# Altium schematic sheet DSP大板子.SchDoc (part 1 of 7)
size 1054 x 800 mm; SheetNumber: 1; SheetTotal: 1
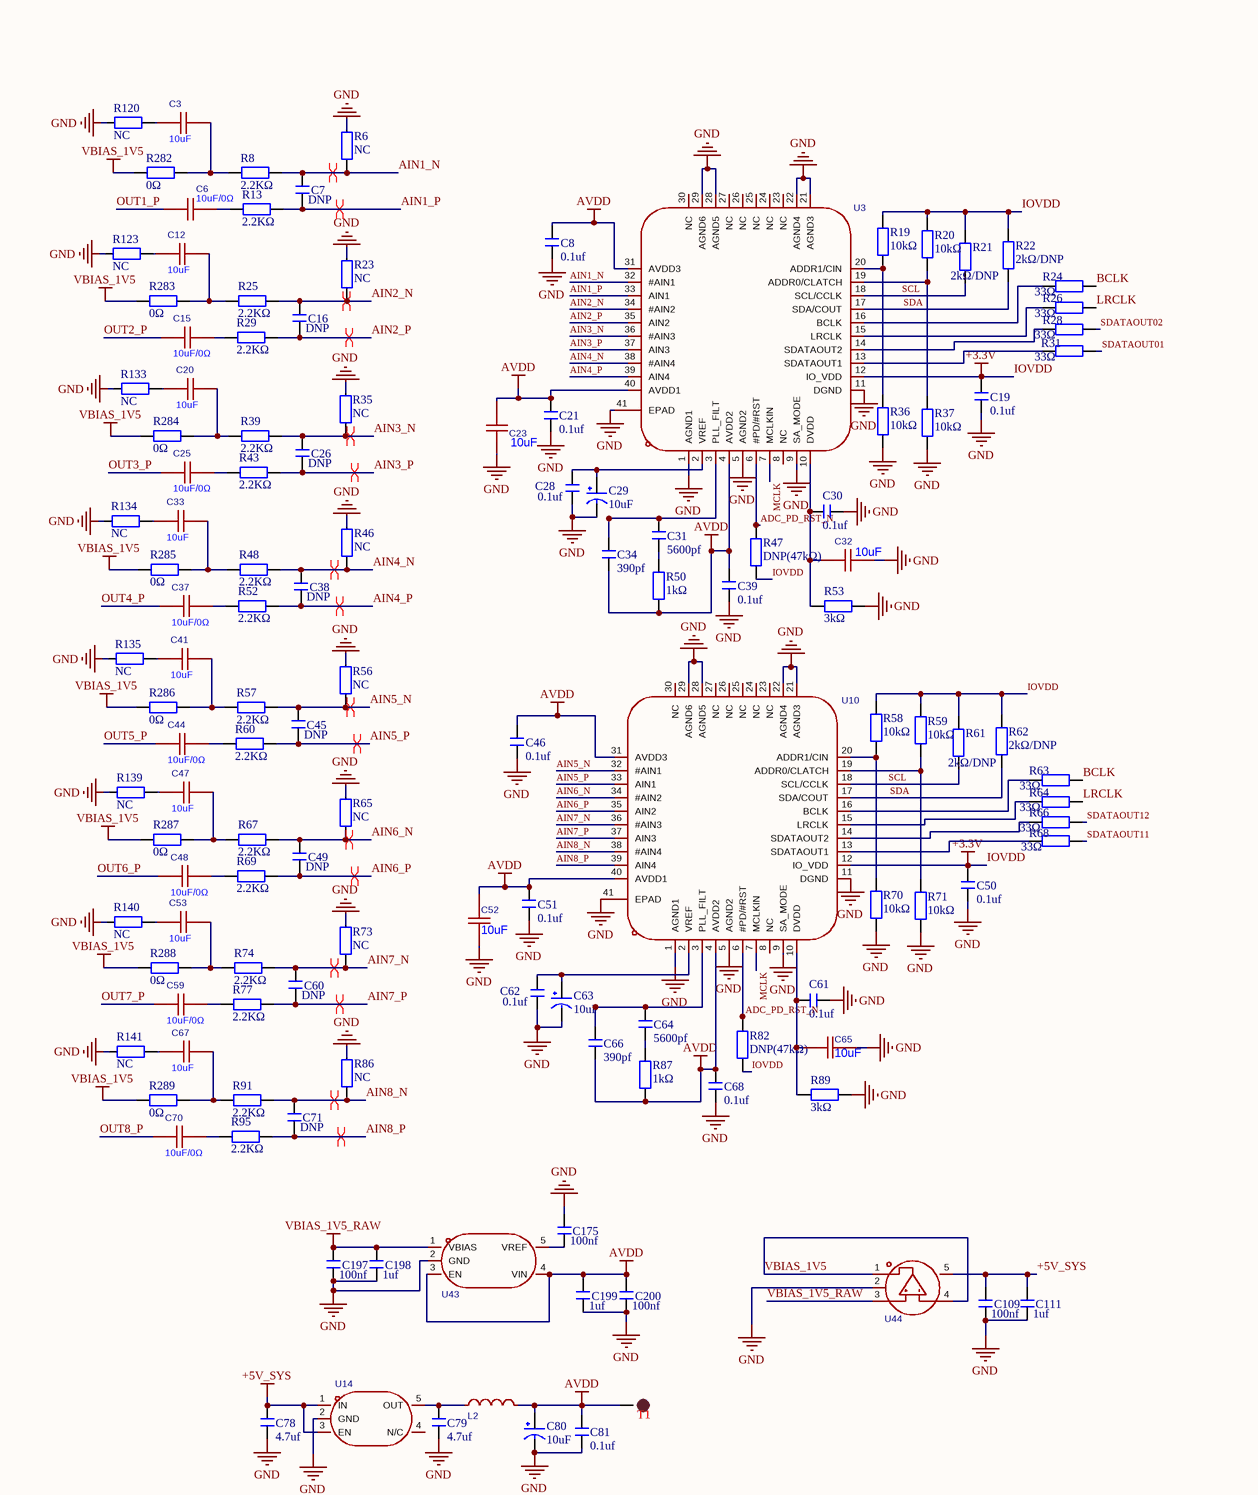
[diagram p0: DSP大板子.SchDoc, top left]
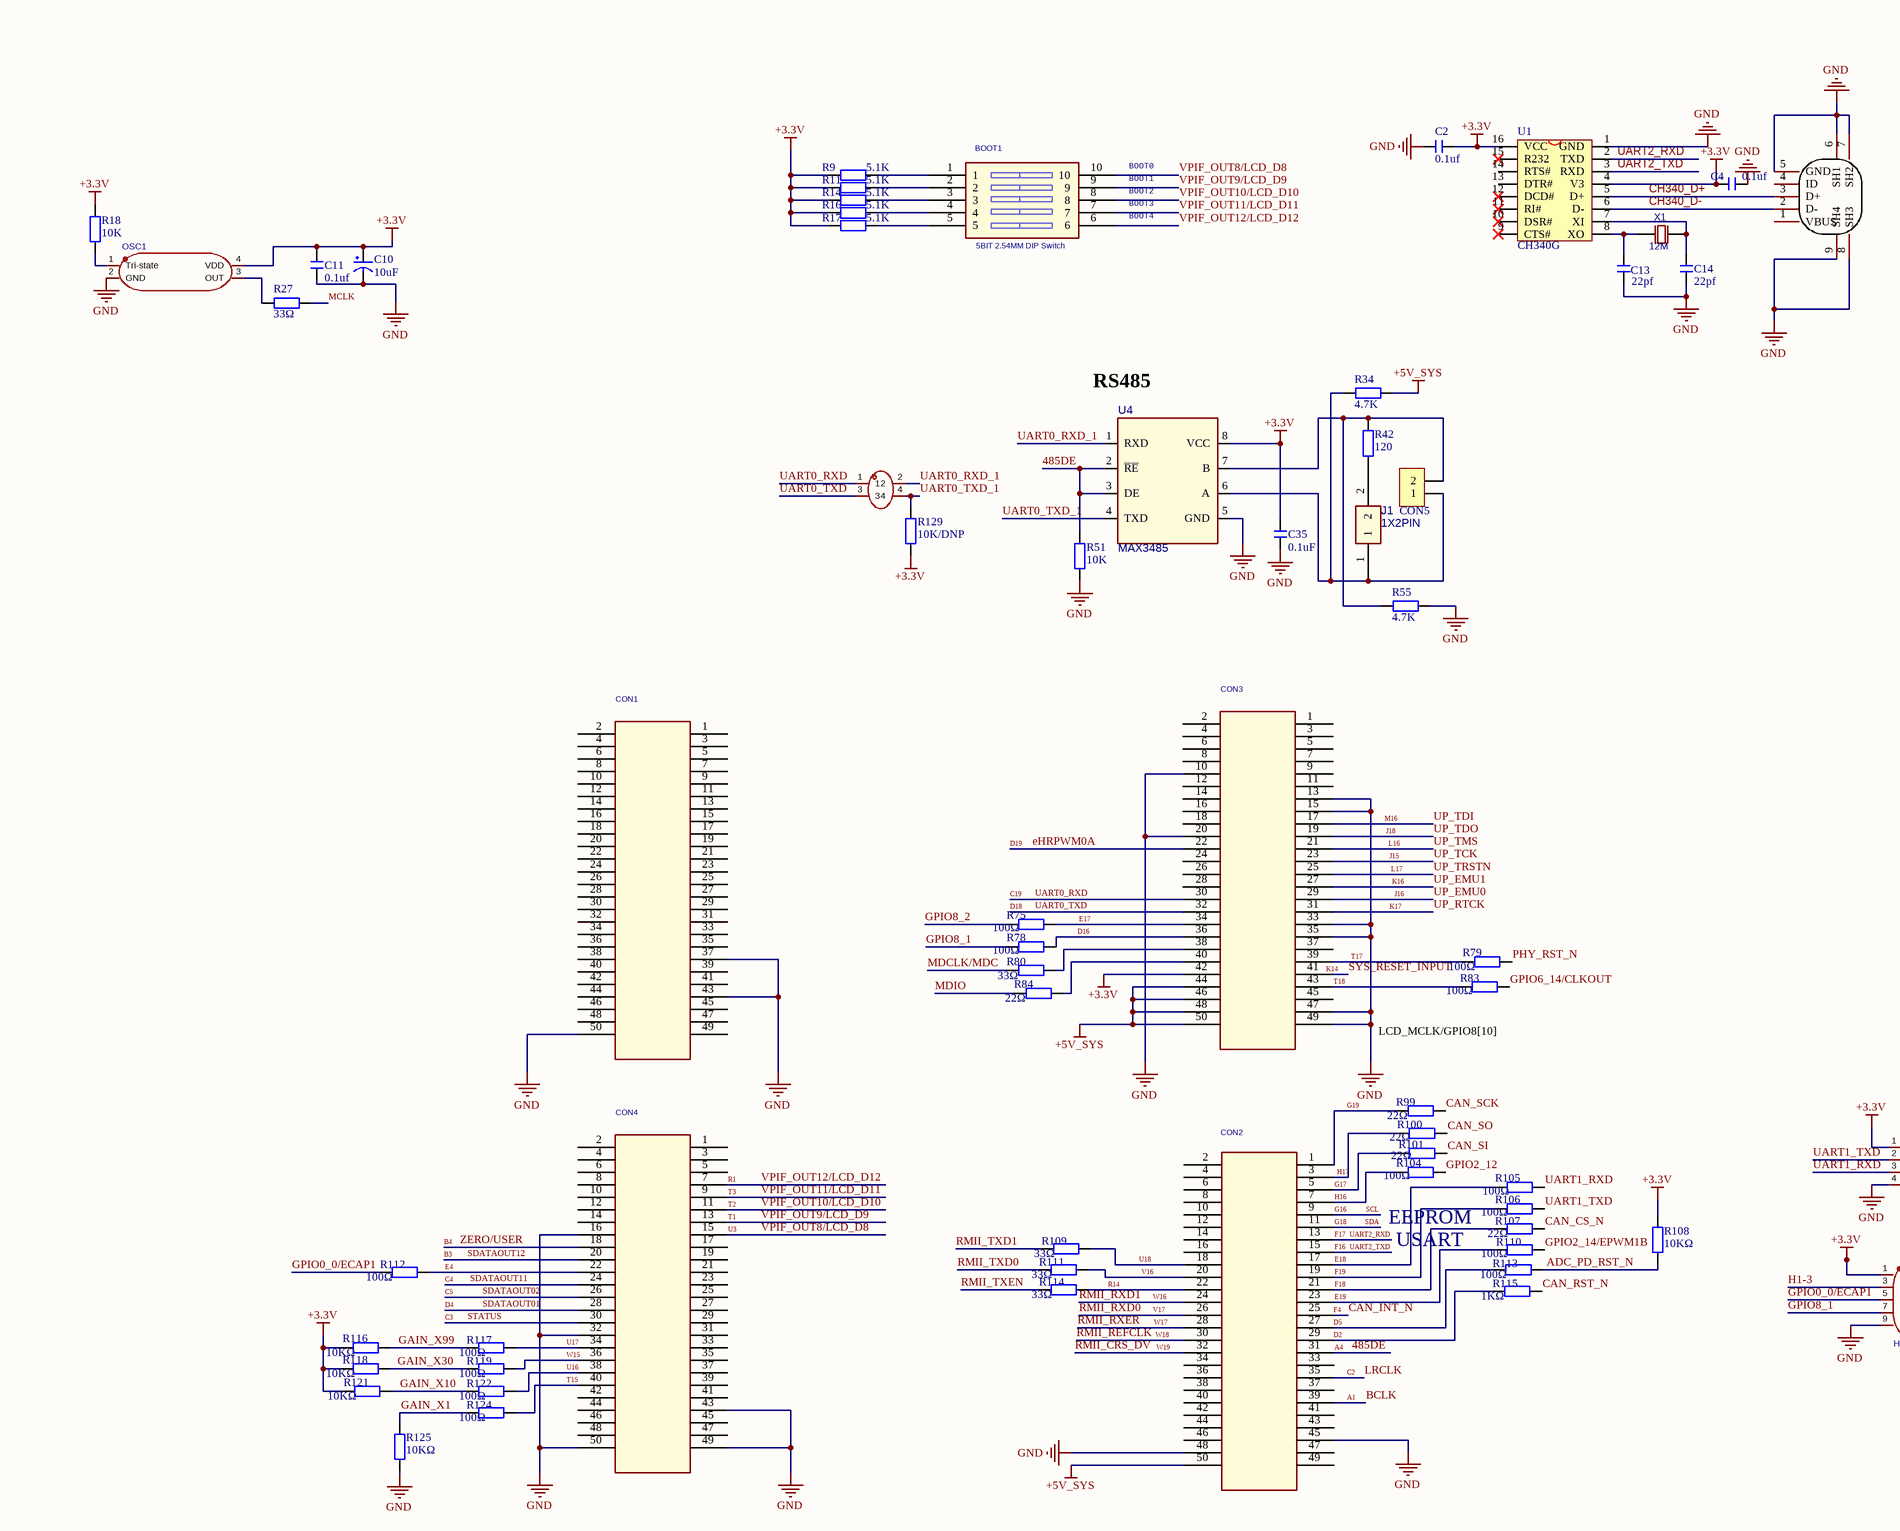
[diagram p1: DSP大板子.SchDoc, top middle]
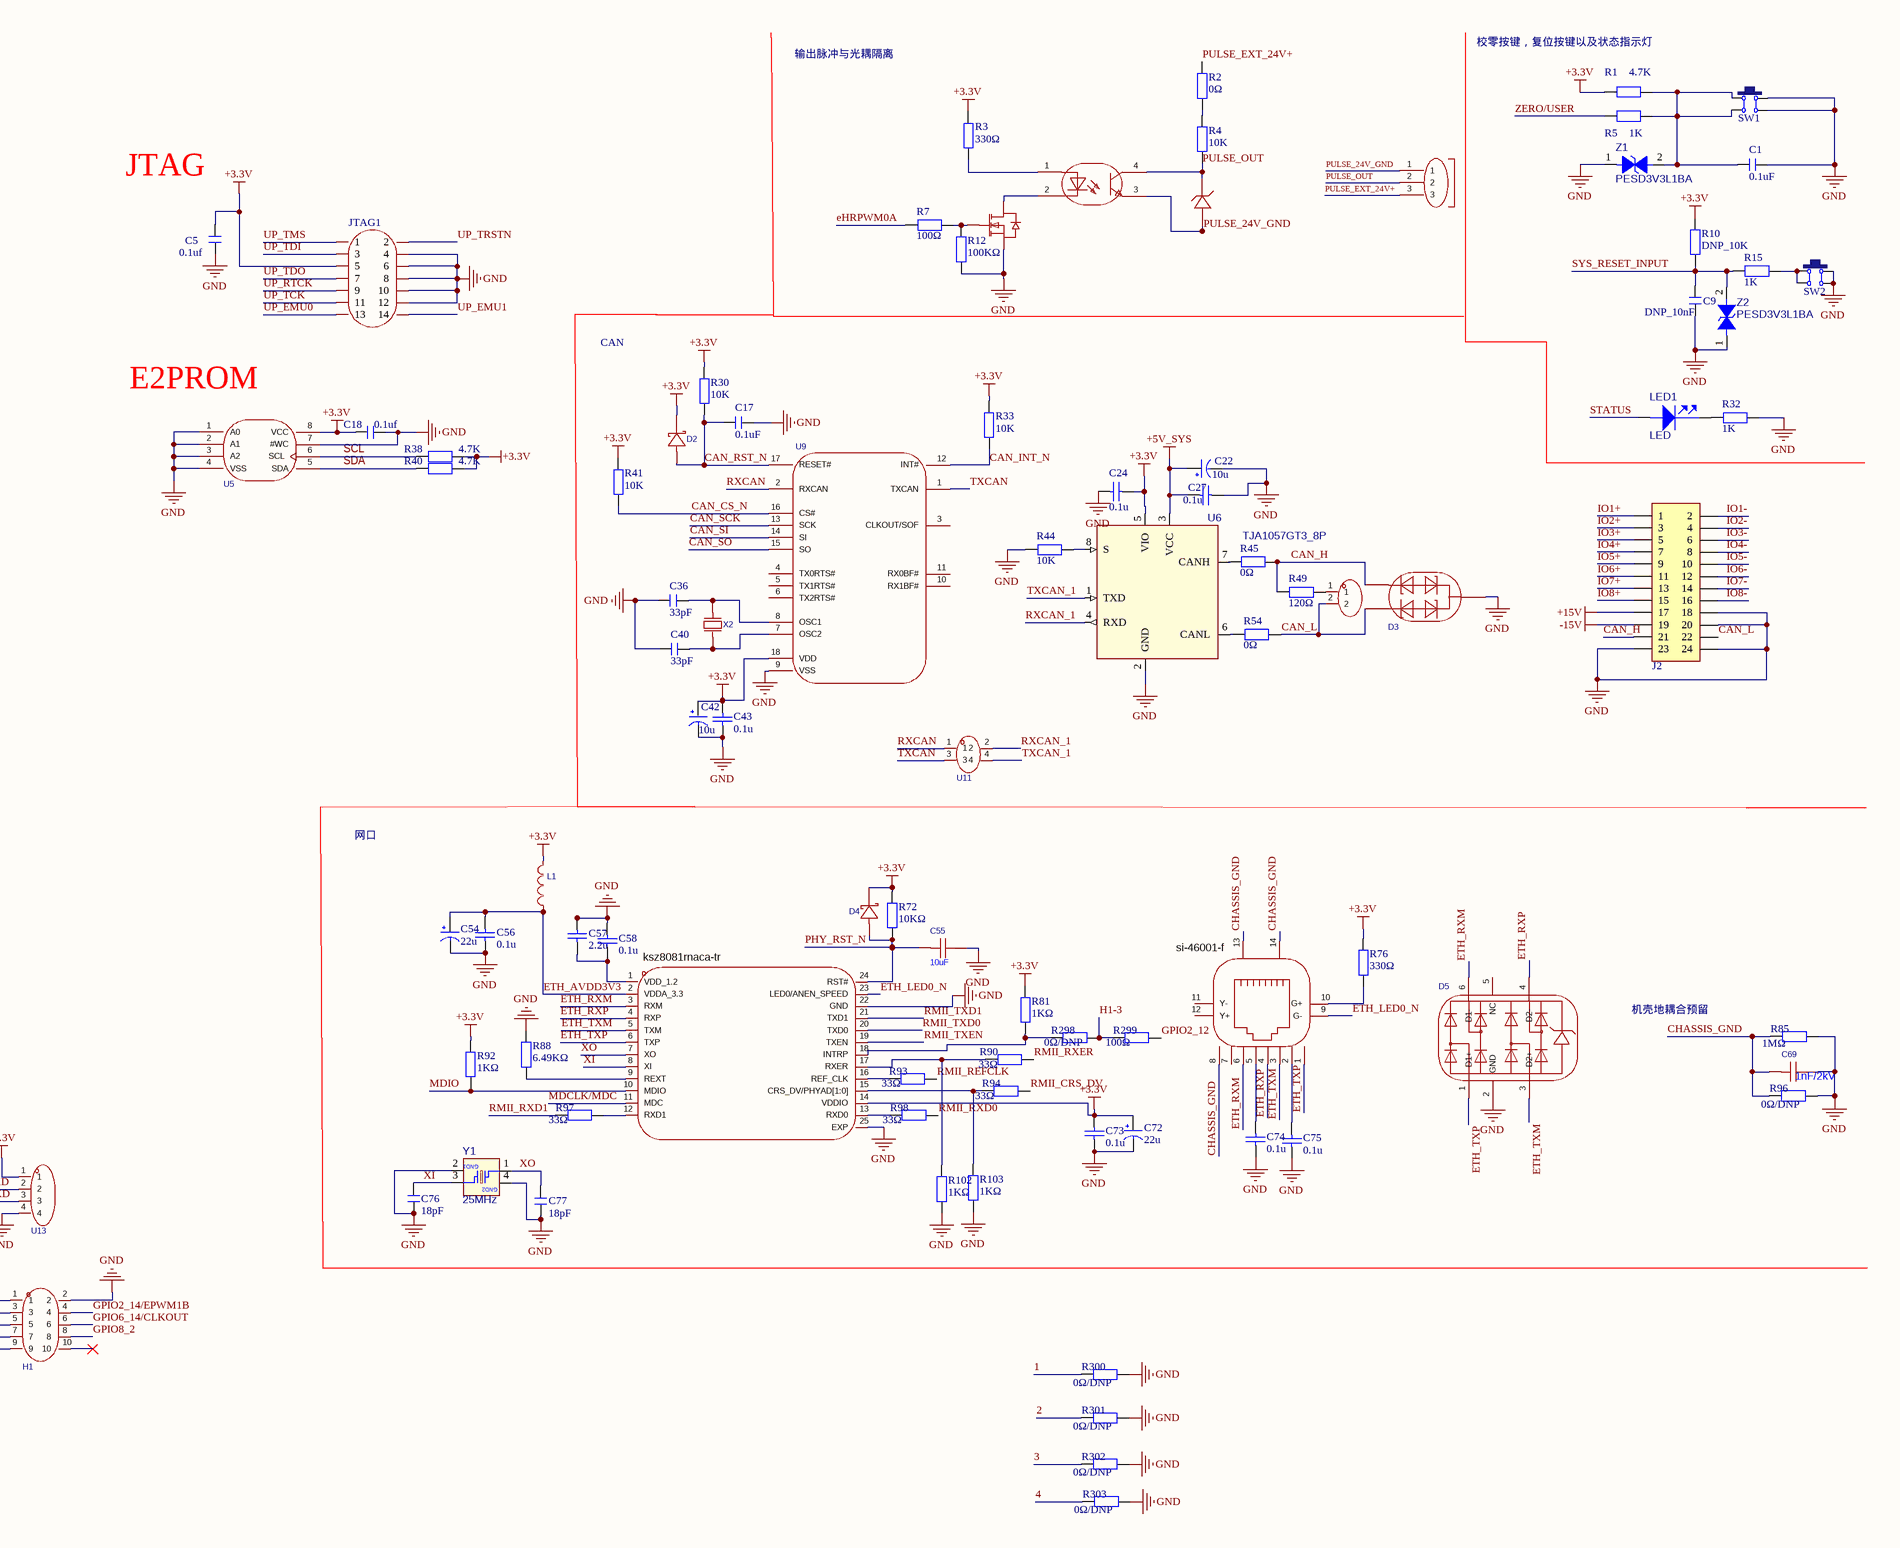
[diagram p2: DSP大板子.SchDoc, top right]
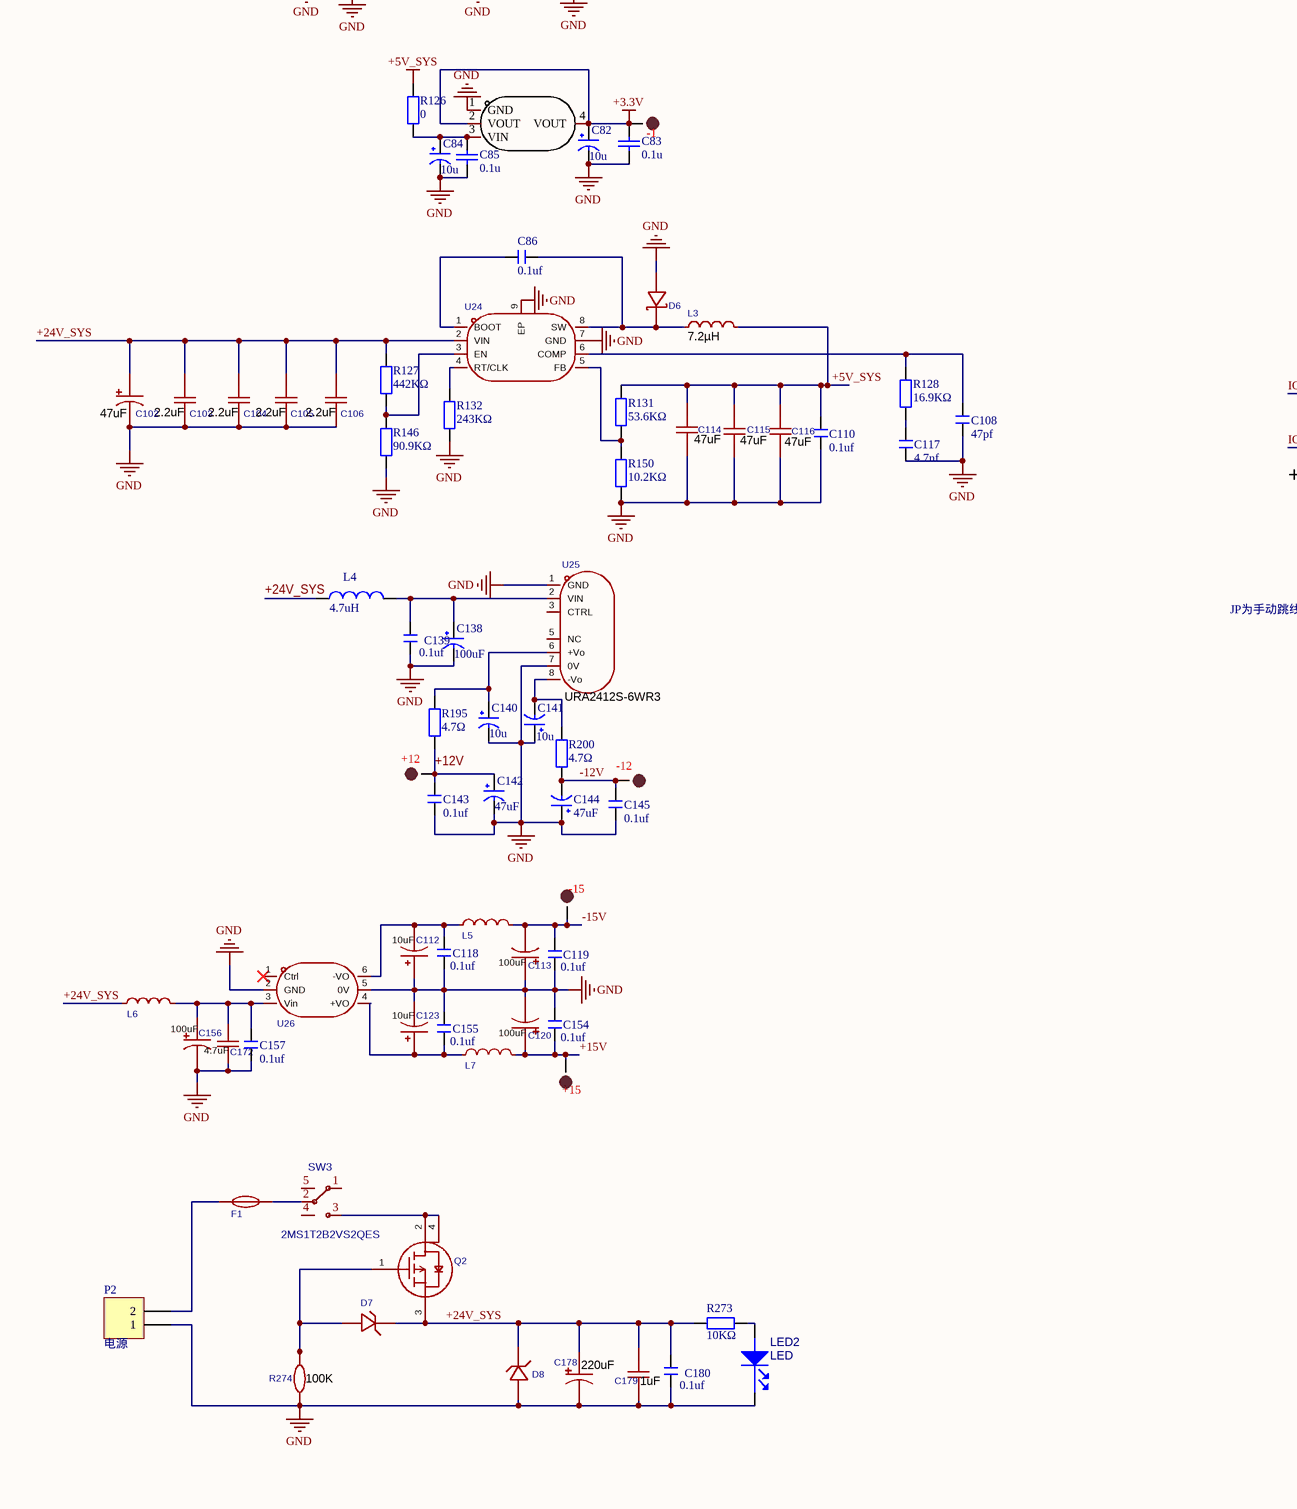
[diagram p3: DSP大板子.SchDoc, bottom left]
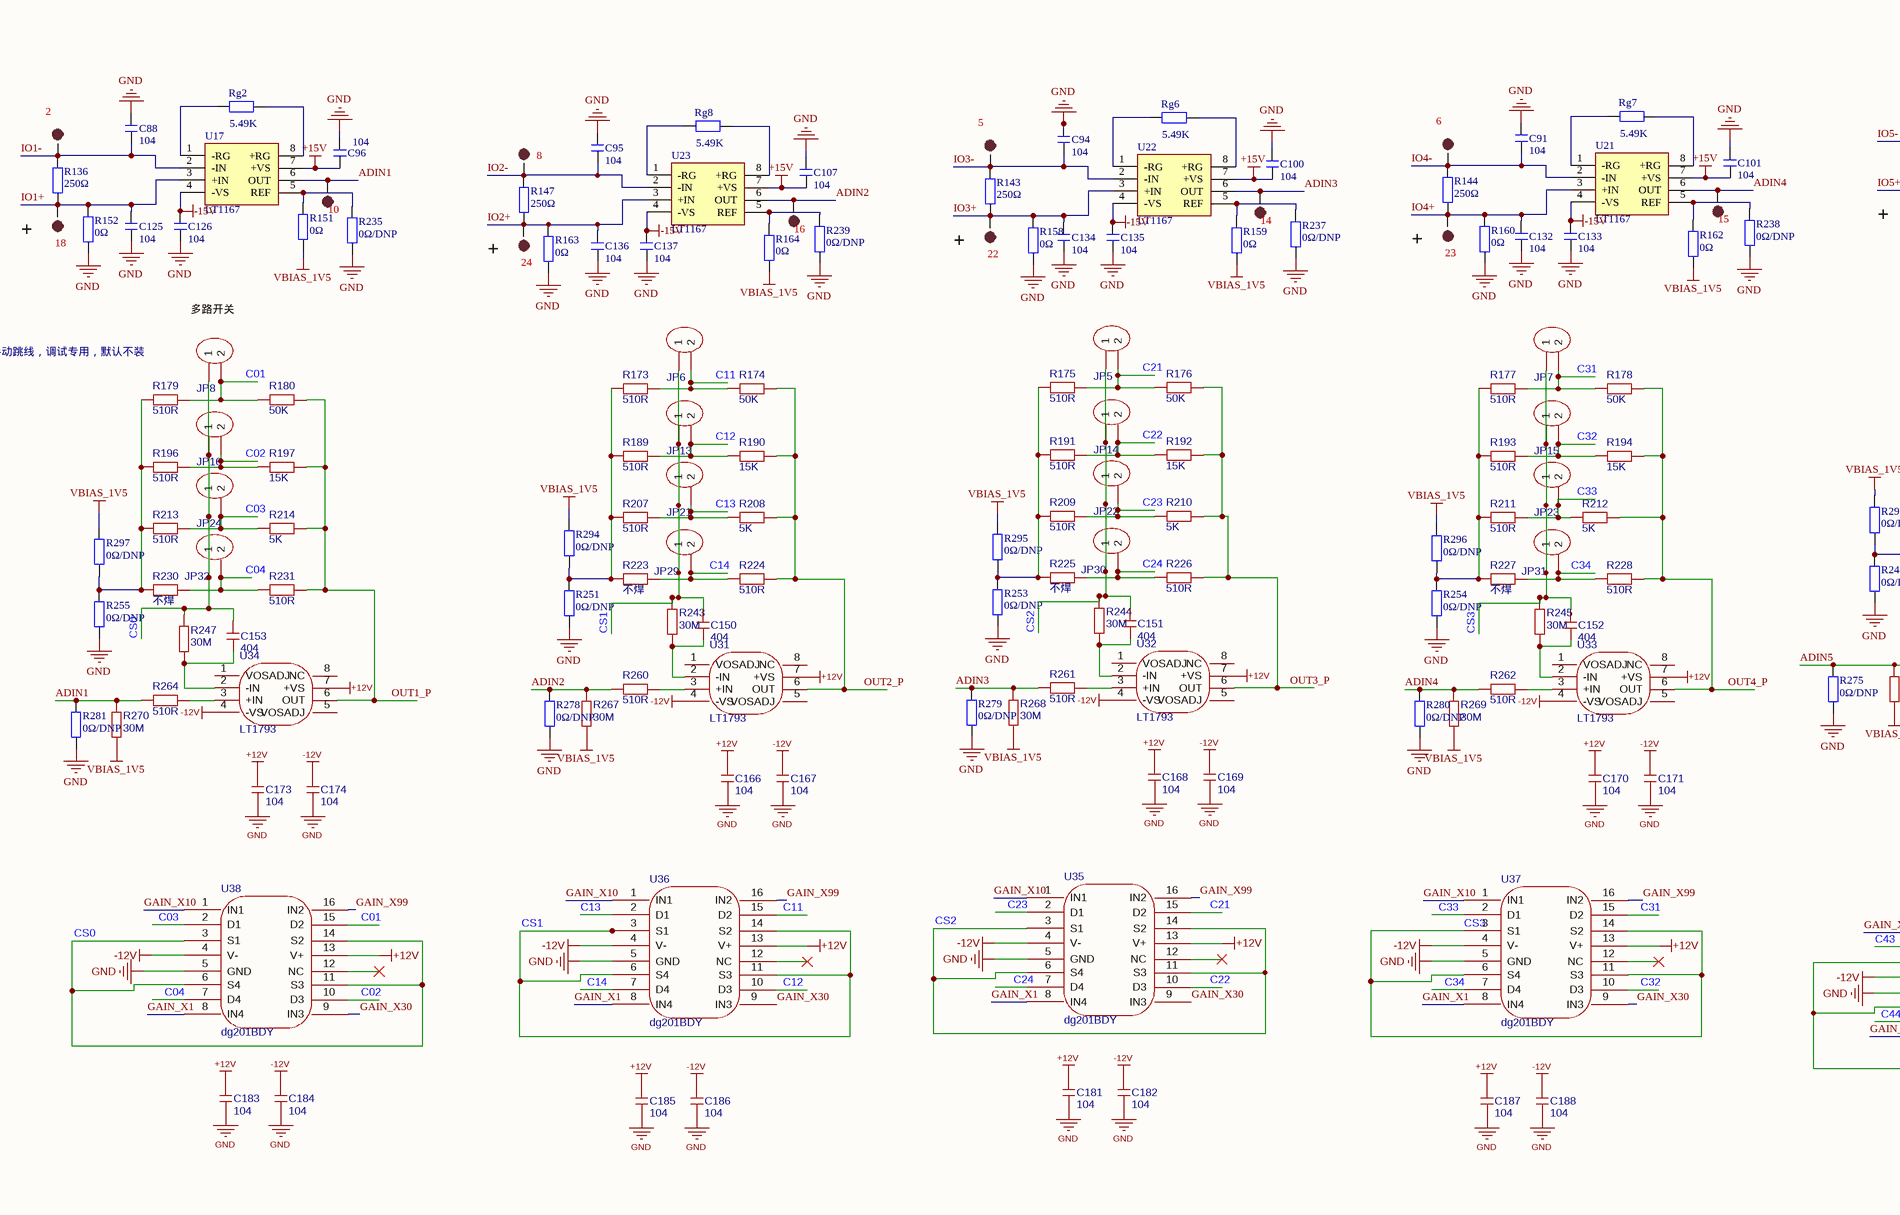
[diagram p4: DSP大板子.SchDoc, bottom middle]
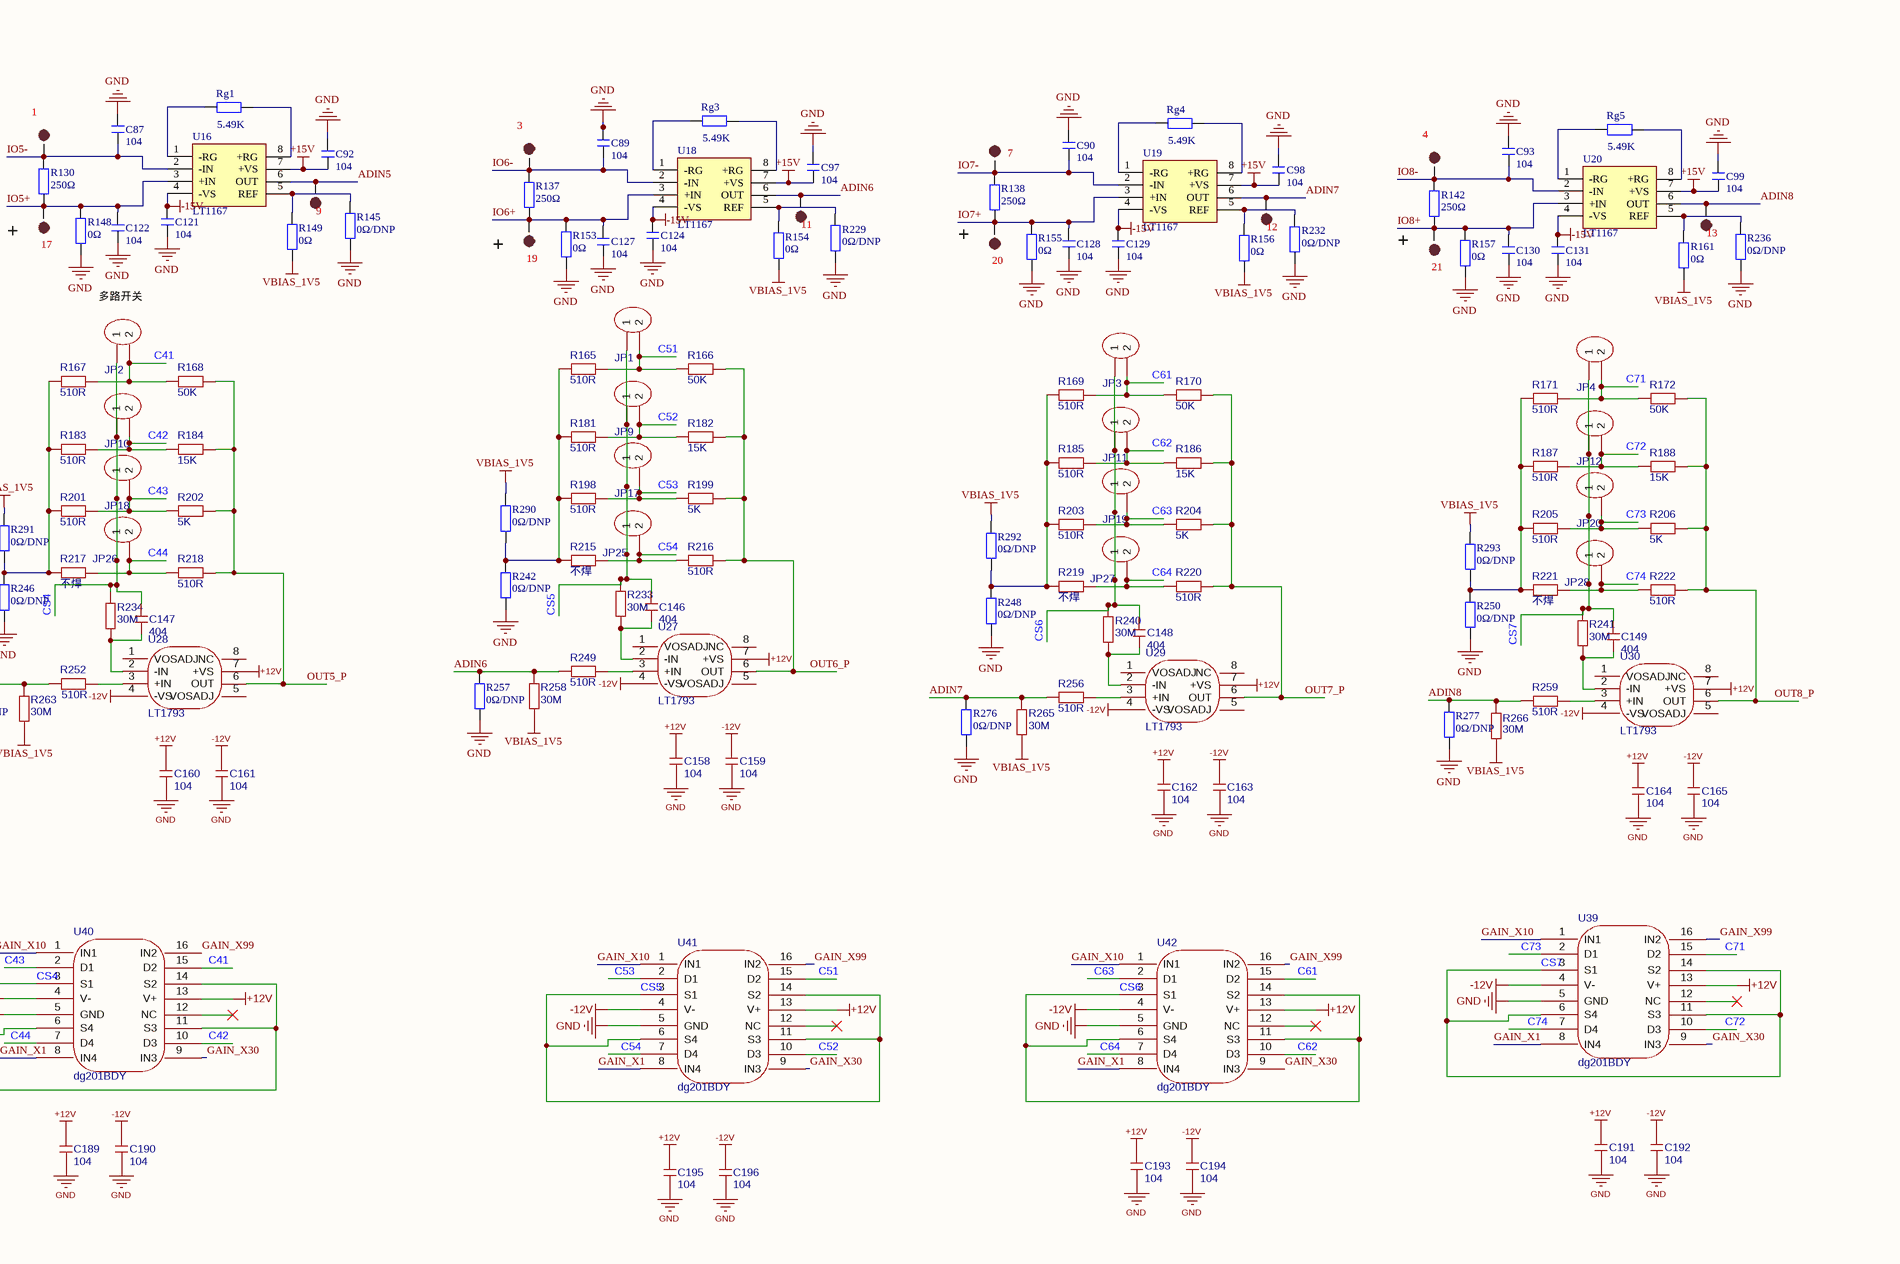
[diagram p5: DSP大板子.SchDoc, bottom right]

## Parts
1  TEST POINT  [TEST]  (value not drawn)
2  TEST POINT  [TEST]  (value not drawn)
3  TEST POINT  [TEST]  (value not drawn)
4  TEST POINT  [TEST]  (value not drawn)
5  TEST POINT  [TEST]  (value not drawn)
6  TEST POINT  [TEST]  (value not drawn)
7  TEST POINT  [TEST]  (value not drawn)
8  TEST POINT  [TEST]  (value not drawn)
9  TEST POINT  [TEST]  (value not drawn)
10  TEST POINT  [TEST]  (value not drawn)
11  TEST POINT  [TEST]  (value not drawn)
12  TEST POINT  [TEST]  (value not drawn)
13  TEST POINT  [TEST]  (value not drawn)
14  TEST POINT  [TEST]  (value not drawn)
15  TEST POINT  [TEST]  (value not drawn)
16  TEST POINT  [TEST]  (value not drawn)
17  TEST POINT  [TEST]  (value not drawn)
18  TEST POINT  [TEST]  (value not drawn)
19  TEST POINT  [TEST]  (value not drawn)
20  TEST POINT  [TEST]  (value not drawn)
21  TEST POINT  [TEST]  (value not drawn)
22  TEST POINT  [TEST]  (value not drawn)
23  TEST POINT  [TEST]  (value not drawn)
24  TEST POINT  [TEST]  (value not drawn)
+12  TEST POINT  [TEST]  (value not drawn)
+15  TEST POINT  [TEST]  (value not drawn)
-1  TEST POINT  [TEST]  (value not drawn)
-12  TEST POINT  [TEST]  (value not drawn)
-15  TEST POINT  [TEST]  (value not drawn)
BOOT1  5BIT 2.54MM DIP Switch  [CON_5PIN_DIP_2D54]
C1  0.1uF  [C 0805_L]
C2  0.1uf  [0603C]
C3  10uF  [C1210]
C4  0.1uf  [0603C]
C5  0.1uf  [0603C]
C6  10uF/0Ω  [C1210]
C7  DNP  [0603C]
C8  0.1uf  [0603C]
C9  DNP_10nF  [0603C]
C10  10uF  [5x11mm]
C11  0.1uf  [0603C]
C12  10uF  [C1210]
C13  22pf  [0603C]
C14  22pf  [0603C]
C15  10uF/0Ω  [C1210]
C16  DNP  [0603C]
C17  0.1uF  [0603C]
C18  0.1uf  [0603C]
C19  0.1uf  [0603C]
C20  10uF  [C1210]
C21  0.1uf  [0603C]
C22  10u  [5x11mm]
C23  10uF  [C1206]
C24  0.1u  [0603C]
C25  10uF/0Ω  [C1210]
C26  DNP  [0603C]
C27  0.1u  [0603C]
C28  0.1uf  [0603C]
C29  10uF  [5x11mm]
C30  0.1uf  [0603C]
C31  5600pf  [0603C]
C32  10uF  [C1206]
C33  10uF  [C1210]
C34  390pf  [0603C]
C35  0.1uF  [0603C]
C36  33pF  [0603C]
C37  10uF/0Ω  [C1210]
C38  DNP  [0603C]
C39  0.1uf  [0603C]
C40  33pF  [0603C]
C41  10uF  [C1210]
C42  10u  [5x11mm]
C43  0.1u  [0603C]
C44  10uF/0Ω  [C1210]
C45  DNP  [0603C]
C46  0.1uf  [0603C]
C47  10uF  [C1210]
C48  10uF/0Ω  [C1210]
C49  DNP  [0603C]
C50  0.1uf  [0603C]
C51  0.1uf  [0603C]
C52  10uF  [C1206]
C53  10uF  [C1210]
C54  22u  [5x11mm]
C55  10uF  [C1210]
C56  0.1u  [0603C]
C57  2.2u  [0603C]
C58  0.1u  [0603C]
C59  10uF/0Ω  [C1210]
C60  DNP  [0603C]
C61  0.1uf  [0603C]
C62  0.1uf  [0603C]
C63  10uF  [5x11mm]
C64  5600pf  [0603C]
C65  10uF  [C1206]
C66  390pf  [0603C]
C67  10uF  [C1210]
C68  0.1uf  [0603C]
C69  1nF/2kV  [C1206]
C70  10uF/0Ω  [C1210]
C71  DNP  [0603C]
C72  22u  [5x11mm]
C73  0.1u  [0603C]
C74  0.1u  [0603C]
C75  0.1u  [0603C]
C76  18pF  [0603C]
C77  18pF  [0603C]
C78  4.7uf  [0603C]
C79  4.7uf  [0603C]
C80  10uF  [5x11mm]
C81  0.1uf  [0603C]
C82  10u  [5x11mm]
C83  0.1u  [0603C]
C84  10u  [5x11mm]
C85  0.1u  [0603C]
C86  0.1uf  [0603C]
C87  104  [0603C]
C88  104  [0603C]
C89  104  [0603C]
C90  104  [0603C]
C91  104  [0603C]
C92  104  [0603C]
C93  104  [0603C]
C94  104  [0603C]
C95  104  [0603C]
C96  104  [0603C]
C97  104  [0603C]
C98  104  [0603C]
C99  104  [0603C]
C100  104  [0603C]
C101  104  [0603C]
C102  47uF  [CAP-TH_BD8.0-P3.50-D0.6-FD]
C103  2.2uF  [C1210]
C104  2.2uF  [C1210]
C105  2.2uF  [C1210]
C106  2.2uF  [C1210]
C107  104  [0603C]
C108  47pf  [0603C]
C109  100nf  [0603C]
C110  0.1uf  [0603C]
C111  1uf  [0603C]
C112  10uF  [CAP-TH_BD6.3-P2.50-D0.6-FD]
C113  100uF  [CAP-TH_BD8.0-P3.50-D0.6-FD_1]
C114  47uF  [C1210]
C115  47uF  [C1210]
C116  47uF  [C1210]
C117  4.7nf  [0603C]
C118  0.1uf  [0603C]
C119  0.1uf  [0603C]
C120  100uF  [CAP-TH_BD8.0-P3.50-D0.6-FD_1]
C121  104  [0603C]
C122  104  [0603C]
C123  10uF  [CAP-TH_BD6.3-P2.50-D0.6-FD]
C124  104  [0603C]
C125  104  [0603C]
C126  104  [0603C]
C127  104  [0603C]
C128  104  [0603C]
C129  104  [0603C]
C130  104  [0603C]
C131  104  [0603C]
C132  104  [0603C]
C133  104  [0603C]
C134  104  [0603C]
C135  104  [0603C]
C136  104  [0603C]
C137  104  [0603C]
C138  100uF  [CAP-TH_BD8.0-P3.50-D0.6-FD]
C139  0.1uf  [0603C]
C140  10u  [5x11mm]
C141  10u  [5x11mm]
C142  47uF  [CAP-TH_BD8.0-P3.50-D0.6-FD]
C143  0.1uf  [0603C]
C144  47uF  [CAP-TH_BD8.0-P3.50-D0.6-FD]
C145  0.1uf  [0603C]
C146  404  [C 0603_L]
C147  404  [C 0603_L]
C148  404  [C 0603_L]
C149  404  [C 0603_L]
C150  404  [C 0603_L]
C151  404  [C 0603_L]
C152  404  [C 0603_L]
C153  404  [C 0603_L]
C154  0.1uf  [0603C]
C155  0.1uf  [0603C]
C156  100uF  [CAP-TH_BD8.0-P3.50-D0.6-FD_1]
C157  0.1uf  [0603C]
C158  104  [C 0603_L]
C159  104  [C 0603_L]
C160  104  [C 0603_L]
C161  104  [C 0603_L]
C162  104  [C 0603_L]
C163  104  [C 0603_L]
C164  104  [C 0603_L]
C165  104  [C 0603_L]
C166  104  [C 0603_L]
C167  104  [C 0603_L]
C168  104  [C 0603_L]
C169  104  [C 0603_L]
C170  104  [C 0603_L]
C171  104  [C 0603_L]
C172  4.7uF  [C1206]
C173  104  [C 0603_L]
C174  104  [C 0603_L]
C175  100nf  [0603C]
C178  220uF  [CAP-TH_BD10.0-P5.00-D1.0-FD]
C179  1uF  [C0805]
C180  0.1uf  [0603C]
C181  104  [C 0603_L]
C182  104  [C 0603_L]
C183  104  [C 0603_L]
C184  104  [C 0603_L]
C185  104  [C 0603_L]
C186  104  [C 0603_L]
C187  104  [C 0603_L]
C188  104  [C 0603_L]
C189  104  [C 0603_L]
C190  104  [C 0603_L]
C191  104  [C 0603_L]
C192  104  [C 0603_L]
C193  104  [C 0603_L]
C194  104  [C 0603_L]
C195  104  [C 0603_L]
C196  104  [C 0603_L]
C197  100nf  [0603C]
C198  1uf  [0603C]
C199  1uf  [0603C]
C200  100nf  [0603C]
CON1  (no value)  [NLWBS05-50C-2.2H]
CON2  (no value)  [NLWBS05-50C-2.2H]
CON3  (no value)  [NLWBS05-50C-2.2H]
CON4  (no value)  [NLWBS05-50C-2.2H]
CON5  HDR-1X2  [KF128-5.08-2P]  (value not drawn)
D1  smbj33a_c224019  [SMB_L4.6-W3.6-LS5.3-RD]  (value not drawn)
D2  1n4148w_c7420318  [SOD-123_L2.7-W1.6-LS3.7-FD]  (value not drawn)
D3  pesd2can,215  [SOT-23-3_L2.9-W1.3-P1.90-LS2.4-BR]  (value not drawn)
D4  1n4148w_c7420318  [SOD-123_L2.7-W1.6-LS3.7-FD]  (value not drawn)
D5  tpd4e1u06dbvr  [SOT-23-6_L2.9-W1.6-P0.95-LS2.8-BR]  (value not drawn)
D6  b560c-13-f  [SMC_L7.1-W6.2-LS8.1-RD]  (value not drawn)
D7  bzt52c12-7-f  [SOD-123_L2.7-W1.6-LS3.7-RD]  (value not drawn)
D8  smbj33a_c224019  [SMB_L4.6-W3.6-LS5.3-RD]  (value not drawn)
F1  0451003.mrl  [FUSE-SMD_L6.1-W2.7]  (value not drawn)
H1  a254up-zs05p  [HDR-TH_10P-P2.54-V-M-R2-C5-S2.54]  (value not drawn)
J1  1X2PIN  [HDR2.54-Y-LI-2P]
J2  Header 2X12  [IDC2.54-LI-2x12P]  (value not drawn)
JP1  HDR-1X2  [HDR2.54-Y-LI-2P]  (value not drawn)
JP2  HDR-1X2  [HDR2.54-Y-LI-2P]  (value not drawn)
JP3  HDR-1X2  [HDR2.54-Y-LI-2P]  (value not drawn)
JP4  HDR-1X2  [HDR2.54-Y-LI-2P]  (value not drawn)
JP5  HDR-1X2  [HDR2.54-Y-LI-2P]  (value not drawn)
JP6  HDR-1X2  [HDR2.54-Y-LI-2P]  (value not drawn)
JP7  HDR-1X2  [HDR2.54-Y-LI-2P]  (value not drawn)
JP8  HDR-1X2  [HDR2.54-Y-LI-2P]  (value not drawn)
JP9  HDR-1X2  [HDR2.54-Y-LI-2P]  (value not drawn)
JP10  HDR-1X2  [HDR2.54-Y-LI-2P]  (value not drawn)
JP11  HDR-1X2  [HDR2.54-Y-LI-2P]  (value not drawn)
JP12  HDR-1X2  [HDR2.54-Y-LI-2P]  (value not drawn)
JP13  HDR-1X2  [HDR2.54-Y-LI-2P]  (value not drawn)
JP14  HDR-1X2  [HDR2.54-Y-LI-2P]  (value not drawn)
JP15  HDR-1X2  [HDR2.54-Y-LI-2P]  (value not drawn)
JP16  HDR-1X2  [HDR2.54-Y-LI-2P]  (value not drawn)
JP17  HDR-1X2  [HDR2.54-Y-LI-2P]  (value not drawn)
JP18  HDR-1X2  [HDR2.54-Y-LI-2P]  (value not drawn)
JP19  HDR-1X2  [HDR2.54-Y-LI-2P]  (value not drawn)
JP20  HDR-1X2  [HDR2.54-Y-LI-2P]  (value not drawn)
JP21  HDR-1X2  [HDR2.54-Y-LI-2P]  (value not drawn)
JP22  HDR-1X2  [HDR2.54-Y-LI-2P]  (value not drawn)
JP23  HDR-1X2  [HDR2.54-Y-LI-2P]  (value not drawn)
JP24  HDR-1X2  [HDR2.54-Y-LI-2P]  (value not drawn)
JP25  HDR-1X2  [HDR2.54-Y-LI-2P]  (value not drawn)
JP26  HDR-1X2  [HDR2.54-Y-LI-2P]  (value not drawn)
JP27  HDR-1X2  [HDR2.54-Y-LI-2P]  (value not drawn)
JP28  HDR-1X2  [HDR2.54-Y-LI-2P]  (value not drawn)
JP29  HDR-1X2  [HDR2.54-Y-LI-2P]  (value not drawn)
JP30  HDR-1X2  [HDR2.54-Y-LI-2P]  (value not drawn)
JP31  HDR-1X2  [HDR2.54-Y-LI-2P]  (value not drawn)
JP32  HDR-1X2  [HDR2.54-Y-LI-2P]  (value not drawn)
JTAG1  (no value)  [IDC-TH_14P-P2.54-V-R2-C7-S2.54]
L1  blm18kg601sn1d  [L0603]  (value not drawn)
L2  mpz1608s221ata00  [L0603]  (value not drawn)
L3  7.2µH  [IND-SMD_L10.2-W10.2_7447798720]
L4  4.7uH  [1210L]
L5  blm31pg121sn1l  [L1206]  (value not drawn)
L6  srn6045ta-4r7m  [IND-SMD_L6.0-W6.0]  (value not drawn)
L7  blm31pg121sn1l  [L1206]  (value not drawn)
LED1  LED  [LED 0805R]
LED2  LED  [LED 0805R]
OSC1  ot2el4c4ji-111olp-24.576m  [OSC-SMD_4P-L3.2-W2.5-BL]  (value not drawn)
P1  wj500v-5.08-03p-14-00a  [CONN-TH_3P-P5.00_WJ500V-5.08-3P]  (value not drawn)
P2  电源  [CONN-TH_2P-P5.08]
Q1  2n7002,215  [SOT-23_L2.9-W1.3-P1.90-LS2.4-BR]  (value not drawn)
Q2  dmp6023le-13  [SOT-223-4_L6.5-W3.5-P2.30-LS7.0-BR]  (value not drawn)
R1  4.7K  [0603R]
R2  0Ω  [0603R]
R3  330Ω  [0603R]
R4  10K  [0603R]
R5  1K  [0603R]
R6  NC  [0603R]
R7  100Ω  [0603R]
R8  2.2KΩ  [0603R]
R9  5.1K  [0603R]
R10  DNP_10K  [0603R]
R11  5.1K  [0603R]
R12  100KΩ  [0603R]
R13  2.2KΩ  [0603R]
R14  5.1K  [0603R]
R15  1K  [0603R]
R16  5.1K  [0603R]
R17  5.1K  [0603R]
R18  10K  [0603R]
R19  10kΩ  [0603R]
R20  10kΩ  [0603R]
R21  2kΩ/DNP  [0603R]
R22  2kΩ/DNP  [0603R]
R23  NC  [0603R]
R24  33Ω  [0603R]
R25  2.2KΩ  [0603R]
R26  33Ω  [0603R]
R27  33Ω  [0603R]
R28  33Ω  [0603R]
R29  2.2KΩ  [0603R]
R30  10K  [0603R]
R31  33Ω  [0603R]
R32  1K  [0603R]
R33  10K  [0603R]
R34  4.7K  [0603R]
R35  NC  [0603R]
R36  10kΩ  [0603R]
R37  10kΩ  [0603R]
R38  4.7K  [0603R]
R39  2.2KΩ  [0603R]
R40  4.7K  [0603R]
R41  10K  [0603R]
R42  120  [0603R]
R43  2.2KΩ  [0603R]
R44  10K  [0603R]
R45  0Ω  [0603R]
R46  NC  [0603R]
R47  DNP(47kΩ)  [0603R]
R48  2.2KΩ  [0603R]
R49  120Ω  [0603R]
R50  1kΩ  [0603R]
R51  10K  [0603R]
R52  2.2KΩ  [0603R]
R53  3kΩ  [0603R]
R54  0Ω  [0603R]
R55  4.7K  [0603R]
R56  NC  [0603R]
R57  2.2KΩ  [0603R]
R58  10kΩ  [0603R]
R59  10kΩ  [0603R]
R60  2.2KΩ  [0603R]
R61  2kΩ/DNP  [0603R]
R62  2kΩ/DNP  [0603R]
R63  33Ω  [0603R]
R64  33Ω  [0603R]
R65  NC  [0603R]
R66  33Ω  [0603R]
R67  2.2KΩ  [0603R]
R68  33Ω  [0603R]
R69  2.2KΩ  [0603R]
R70  10kΩ  [0603R]
R71  10kΩ  [0603R]
R72  10KΩ  [0603R]
R73  NC  [0603R]
R74  2.2KΩ  [0603R]
R75  100Ω  [0603R]
R76  330Ω  [0603R]
R77  2.2KΩ  [0603R]
R78  100Ω  [0603R]
R79  100Ω  [0603R]
R80  33Ω  [0603R]
R81  1KΩ  [0603R]
R82  DNP(47kΩ)  [0603R]
R83  100Ω  [0603R]
R84  22Ω  [0603R]
R85  1MΩ  [0603R]
R86  NC  [0603R]
R87  1kΩ  [0603R]
R88  6.49KΩ  [0603R]
R89  3kΩ  [0603R]
R90  33Ω  [0603R]
R91  2.2KΩ  [0603R]
R92  1KΩ  [0603R]
R93  33Ω  [0603R]
R94  33Ω  [0603R]
R95  2.2KΩ  [0603R]
R96  0Ω/DNP  [0603R]
R97  33Ω  [0603R]
R98  33Ω  [0603R]
R99  22Ω  [0603R]
R100  22Ω  [0603R]
R101  22Ω  [0603R]
R102  1KΩ  [0603R]
R103  1KΩ  [0603R]
R104  100Ω  [0603R]
R105  100Ω  [0603R]
R106  100Ω  [0603R]
R107  22Ω  [0603R]
R108  10KΩ  [0603R]
R109  33Ω  [0603R]
R110  100Ω  [0603R]
R111  33Ω  [0603R]
R112  100Ω  [0603R]
R113  100Ω  [0603R]
R114  33Ω  [0603R]
R115  1KΩ  [0603R]
R116  10KΩ  [0603R]
R117  100Ω  [0603R]
R118  10KΩ  [0603R]
R119  100Ω  [0603R]
R120  NC  [0603R]
R121  10KΩ  [0603R]
R122  100Ω  [0603R]
R123  NC  [0603R]
R124  100Ω  [0603R]
R125  10KΩ  [0603R]
R126  0  [0603R]
R127  442KΩ  [0603R]
R128  16.9KΩ  [0603R]
R129  10K/DNP  [0603R]
R130  250Ω  [0603R]
R131  53.6KΩ  [0603R]
R132  243KΩ  [0603R]
R133  NC  [0603R]
R134  NC  [0603R]
R135  NC  [0603R]
R136  250Ω  [0603R]
R137  250Ω  [0603R]
R138  250Ω  [0603R]
R139  NC  [0603R]
R140  NC  [0603R]
R141  NC  [0603R]
R142  250Ω  [0603R]
R143  250Ω  [0603R]
R144  250Ω  [0603R]
R145  0Ω/DNP  [0603R]
R146  90.9KΩ  [0603R]
R147  250Ω  [0603R]
R148  0Ω  [0603R]
R149  0Ω  [0603R]
R150  10.2KΩ  [0603R]
R151  0Ω  [0603R]
R152  0Ω  [0603R]
R153  0Ω  [0603R]
R154  0Ω  [0603R]
R155  0Ω  [0603R]
R156  0Ω  [0603R]
R157  0Ω  [0603R]
R158  0Ω  [0603R]
R159  0Ω  [0603R]
R160  0Ω  [0603R]
R161  0Ω  [0603R]
R162  0Ω  [0603R]
R163  0Ω  [0603R]
R164  0Ω  [0603R]
R165  510R  [0603R]
R166  50K  [0603R]
R167  510R  [0603R]
R168  50K  [0603R]
R169  510R  [0603R]
R170  50K  [0603R]
R171  510R  [0603R]
R172  50K  [0603R]
R173  510R  [0603R]
R174  50K  [0603R]
R175  510R  [0603R]
R176  50K  [0603R]
R177  510R  [0603R]
R178  50K  [0603R]
R179  510R  [0603R]
R180  50K  [0603R]
R181  510R  [0603R]
R182  15K  [0603R]
R183  510R  [0603R]
R184  15K  [0603R]
R185  510R  [0603R]
R186  15K  [0603R]
R187  510R  [0603R]
R188  15K  [0603R]
R189  510R  [0603R]
R190  15K  [0603R]
R191  510R  [0603R]
R192  15K  [0603R]
R193  510R  [0603R]
R194  15K  [0603R]
R195  4.7Ω  [0603R]
R196  510R  [0603R]
R197  15K  [0603R]
R198  510R  [0603R]
R199  5K  [0603R]
R200  4.7Ω  [0603R]
R201  510R  [0603R]
R202  5K  [0603R]
R203  510R  [0603R]
R204  5K  [0603R]
R205  510R  [0603R]
R206  5K  [0603R]
R207  510R  [0603R]
R208  5K  [0603R]
R209  510R  [0603R]
R210  5K  [0603R]
R211  510R  [0603R]
R212  5K  [0603R]
R213  510R  [0603R]
R214  5K  [0603R]
R215  不焊  [0603R]
R216  510R  [0603R]
R217  不焊  [0603R]
R218  510R  [0603R]
R219  不焊  [0603R]
R220  510R  [0603R]
R221  不焊  [0603R]
R222  510R  [0603R]
R223  不焊  [0603R]
R224  510R  [0603R]
R225  不焊  [0603R]
R226  510R  [0603R]
R227  不焊  [0603R]
R228  510R  [0603R]
R229  0Ω/DNP  [0603R]
R230  不焊  [0603R]
R231  510R  [0603R]
R232  0Ω/DNP  [0603R]
R233  30M  [0603R]
R234  30M  [0603R]
R235  0Ω/DNP  [0603R]
R236  0Ω/DNP  [0603R]
R237  0Ω/DNP  [0603R]
R238  0Ω/DNP  [0603R]
R239  0Ω/DNP  [0603R]
R240  30M  [0603R]
R241  30M  [0603R]
R242  0Ω/DNP  [0603R]
R243  30M  [0603R]
R244  30M  [0603R]
R245  30M  [0603R]
R246  0Ω/DNP  [0603R]
R247  30M  [0603R]
R248  0Ω/DNP  [0603R]
R249  510R  [0603R]
R250  0Ω/DNP  [0603R]
R251  0Ω/DNP  [0603R]
R252  510R  [0603R]
R253  0Ω/DNP  [0603R]
R254  0Ω/DNP  [0603R]
R255  0Ω/DNP  [0603R]
R256  510R  [0603R]
R257  0Ω/DNP  [0603R]
R258  30M  [0603R]
R259  510R  [0603R]
R260  510R  [0603R]
R261  510R  [0603R]
R262  510R  [0603R]
R263  30M  [0603R]
R264  510R  [0603R]
R265  30M  [0603R]
R266  30M  [0603R]
R267  30M  [0603R]
R268  30M  [0603R]
R269  30M  [0603R]
R270  30M  [0603R]
R273  10KΩ  [0603R]
R274  100K  [R0805_NEW]
R275  0Ω/DNP  [0603R]
R276  0Ω/DNP  [0603R]
R277  0Ω/DNP  [0603R]
R278  0Ω/DNP  [0603R]
R279  0Ω/DNP  [0603R]
R280  0Ω/DNP  [0603R]
R281  0Ω/DNP  [0603R]
R282  0Ω  [0603R]
R283  0Ω  [0603R]
R284  0Ω  [0603R]
R285  0Ω  [0603R]
R286  0Ω  [0603R]
R287  0Ω  [0603R]
R288  0Ω  [0603R]
R289  0Ω  [0603R]
R290  0Ω/DNP  [0603R]
R291  0Ω/DNP  [0603R]
R292  0Ω/DNP  [0603R]
R293  0Ω/DNP  [0603R]
R294  0Ω/DNP  [0603R]
R295  0Ω/DNP  [0603R]
R296  0Ω/DNP  [0603R]
R297  0Ω/DNP  [0603R]
R298  0Ω/DNP  [0603R]
R299  100Ω  [0603R]
R300  0Ω/DNP  [0603R]
R301  0Ω/DNP  [0603R]
R302  0Ω/DNP  [0603R]
R303  0Ω/DNP  [0603R]
Rg1  5.49K  [0603R]
Rg2  5.49K  [0603R]
Rg3  5.49K  [0603R]
Rg4  5.49K  [0603R]
Rg5  5.49K  [0603R]
Rg6  5.49K  [0603R]
Rg7  5.49K  [0603R]
Rg8  5.49K  [0603R]
RJ1  si-46001-f  [RJ45-TH_BELFUSE_SI-46001-F]
SW1  SW_PB_ESW  [TSW SMD-6*6*4.3]  (value not drawn)
SW2  SW_PB_ESW  [TSW SMD-6*6*4.3]  (value not drawn)
SW3  2MS1T2B2VS2QES  [SW-TH_2MS1T2B2VS2QES]
T1  TEST POINT  [TEST]  (value not drawn)
U1  CH340G  [SOP16M]
U2  pc817x2csp9f  [SMD-4_L4.6-W6.5-P2.54-LS10.2-TL]  (value not drawn)
U3  adau1979wbcpz-rl  [QFN-40_L6.0-W6.0-P0.50-TL-EP4.1]  (value not drawn)
U4  MAX3485  [SOIC-8]
U5  m24c64-rmn6tp  [SOIC-8_L5.0-W4.0-P1.27-LS6.0-BL]  (value not drawn)
U6  TJA1057GT3_8P  [SOIC-8]
U7  gpha201-0202a001a1ba  [HDR-TH_4P-P2.54-V-M-R2-C2-S2.54]  (value not drawn)
U8  hx pz2.54-1x2p zz  [HDR-TH_2P-P2.54-V-M-3]  (value not drawn)
U9  mcp2515t-i/so  [SOIC-18_L11.6-W7.5-P1.27-LS10.3-BL]  (value not drawn)
U10  adau1979wbcpz-rl  [QFN-40_L6.0-W6.0-P0.50-TL-EP4.1]  (value not drawn)
U11  gpha201-0202a001a1ba  [HDR-TH_4P-P2.54-V-M-R2-C2-S2.54]  (value not drawn)
U12  ksz8081rnaca-tr  [QFN-24_L4.0-W4.0-P0.50-BL-EP2.6]
U13  gpha101-0402a001a1ba  [HDR-TH_4P-P2.54-V-M]  (value not drawn)
U14  lp5907mfx-3.3/nopb  [SOT-23-5_L3.0-W1.7-P0.95-LS2.8-BR]  (value not drawn)
U15  AMS1117-3.3_C6186  [SOT-223-3_L6.5-W3.4-P2.30-LS7.0-BR]  (value not drawn)
U16  LT1167  [SO-8]
U17  LT1167  [SO-8]
U18  LT1167  [SO-8]
U19  LT1167  [SO-8]
U20  LT1167  [SO-8]
U21  LT1167  [SO-8]
U22  LT1167  [SO-8]
U23  LT1167  [SO-8]
U24  tps54560bddar  [POWERPAD-SO-8_L4.9-W3.9-P1.27-LS6.0-BL-EP]  (value not drawn)
U25  URA2412S-6WR3  [PWRM-TH_URAXXXXS-6WR3]
U26  ura2415ymd-15wr3  [PWRM-TH_URA2415YMD-15WR3]  (value not drawn)
U27  LT1793  [SOP-8]
U28  LT1793  [SOP-8]
U29  LT1793  [SOP-8]
U30  LT1793  [SOP-8]
U31  LT1793  [SOP-8]
U32  LT1793  [SOP-8]
U33  LT1793  [SOP-8]
U34  LT1793  [SOP-8]
U35  dg201BDY  [dg201BDY]
U36  dg201BDY  [dg201BDY]
U37  dg201BDY  [dg201BDY]
U38  dg201BDY  [dg201BDY]
U39  dg201BDY  [dg201BDY]
U40  dg201BDY  [dg201BDY]
U41  dg201BDY  [dg201BDY]
U42  dg201BDY  [dg201BDY]
U43  ref2030aiddcr  [SOT-23-5_L2.9-W1.6-P0.95-LS2.8-BL]  (value not drawn)
U44  opa192idbvr  [SOT-23-5_L3.0-W1.7-P0.95-LS2.8-BL]  (value not drawn)
USB1  MicroXNJ  [MICRO-USB-SMD_MICROXNJ]  (value not drawn)
X1  12M  [HC-49S_L11.4-W4.8 - duplicate]
X2  x503216msb2gi  [OSC-SMD_L5.0-W3.2]  (value not drawn)
Y1  25MHz  [SMD3225-4P]
Z1  PESD3V3L1BA  [SOD-323]
Z2  PESD3V3L1BA  [SOD-323]

## Nets
+5V_SYS: C22.1(VCC) C27.1 C78.2 C109.2 C110.2 C111.2 C114.1 C115.1 C116.1 CON2.50 CON3.44 CON3.46 CON3.48 CON3.50 L3.2 R34.2 R126.1 R131.2 U6.3(VCC) U14.1(IN) U14.3(EN) U44.5(V+)
+12V: +12.1 C142.1(VCC) C143.1 C158.2 C160.2 C162.2 C164.2 C166.2 C168.2 C170.2 C173.2 C181.2 C183.2 C185.2 C187.2 C189.2 C191.2 C193.2 C195.2 R195.1 U27.7(+VS) U28.7(+VS) U29.7(+VS) U30.7(+VS) U31.7(+VS) U32.7(+VS) U33.7(+VS) U34.7(+VS) U35.13(V+) U36.13(V+) U37.13(V+) U38.13(V+) U39.13(V+) U40.13(V+) U41.13(V+) U42.13(V+)
+15V: +15.1 C92.1 C96.1 C97.1 C98.1 C99.1 C100.1 C101.1 C107.1 C120.1 C154.2 J2.17 L7.2 U16.7(+VS) U17.7(+VS) U18.7(+VS) U19.7(+VS) U20.7(+VS) U21.7(+VS) U22.7(+VS) U23.7(+VS)
-12V: -12.1 C144.2(GND) C145.1 C159.2 C161.2 C163.2 C165.2 C167.2 C169.2 C171.2 C174.2 C182.2 C184.2 C186.2 C188.2 C190.2 C192.2 C194.2 C196.2 R200.1 U27.4(-VS) U28.4(-VS) U29.4(-VS) U30.4(-VS) U31.4(-VS) U32.4(-VS) U33.4(-VS) U34.4(-VS) U35.4(V-) U36.4(V-) U37.4(V-) U38.4(V-) U39.4(V-) U40.4(V-) U41.4(V-) U42.4(V-)
-15V: -15.1 C113.2 C119.1 C121.2 C124.2 C126.2 C129.2 C131.2 C133.2 C135.2 C137.2 J2.19 L5.2 U16.4(-VS) U17.4(-VS) U18.4(-VS) U19.4(-VS) U20.4(-VS) U21.4(-VS) U22.4(-VS) U23.4(-VS)
AVDD: C8.2 C21.2 C23.2 C34.2 C39.1 C46.1 C51.1 C52.2 C66.2 C68.1 C80.1(VCC) C81.2 C199.2 C200.2 L2.2 R50.2 R87.2 T1.1 U3.4(AVDD2) U3.31(AVDD3) U3.40(AVDD1) U10.4(AVDD2) U10.31(AVDD3) U10.40(AVDD1) U43.3(EN) U43.4(VIN)
GND: C1.1 C2.2 C4.2 C5.2 C8.1 C9.1 C10.2(GND) C11.1 C13.1 C14.1 C17.1 C18.2 C19.2 C21.1 C22.2(GND) C23.1 C24.2 C27.2 C28.2 C29.2(GND) C30.1 C32.1 C35.1 C36.2 C39.2 C40.2 C42.2(GND) C43.2 C46.2 C50.2 C51.2 C52.1 C54.2(GND) C55.1 C56.2 C57.1 C58.1 C61.1 C62.2 C63.2(GND) C65.1 C68.2 C69.1 C72.2(GND) C73.2 C74.2 C75.2 C76.1 C77.1 C78.1 C79.1 C80.2(GND) C81.1 C82.2(GND) C83.2 C84.2(GND) C85.2 C87.2 C88.2 C89.2 C90.2 C91.2 C92.2 C93.2 C94.2 C95.2 C96.2 C97.2 C98.2 C99.2 C100.2 C101.2 C102.2 C103.2 C104.2 C105.2 C106.2 C107.2 C108.1 C109.1 C110.1 C111.1 C112.1 C113.1 C114.2 C115.2 C116.2 C117.1 C118.2 C119.2 C120.2 C121.1 C122.1 C123.2 C124.1 C125.1 C126.1 C127.1 C128.1 C129.1 C130.1 C131.1 C132.1 C133.1 C134.1 C135.1 C136.1 C137.1 C138.2(GND) C139.2 C140.2(GND) C141.1(VCC) C142.2(GND) C143.2 C144.1(VCC) C145.2 C154.1 C155.1 C156.2 C157.2 C158.1 C159.1 C160.1 C161.1 C162.1 C163.1 C164.1 C165.1 C166.1 C167.1 C168.1 C169.1 C170.1 C171.1 C172.1 C173.1 C174.1 C175.2 C178.2 C179.1 C180.2 C181.1 C182.1 C183.1 C184.1 C185.1 C186.1 C187.1 C188.1 C189.1 C190.1 C191.1 C192.1 C193.1 C194.1 C195.1 C196.1 C197.1 C198.1 C199.1 C200.1 CON1.37 CON1.43 CON1.50 CON2.45 CON2.48 CON3.10 CON3.13 CON3.15 CON3.20 CON3.33 CON3.35 CON3.47 CON3.49 CON4.16 CON4.32 CON4.43 CON4.49 CON4.50 D3.3 D5.2(GND) D6.2(A) D8.2(A) H1.2 H1.9 J2.18 J2.20 J2.23 J2.24 JTAG1.4 JTAG1.6 JTAG1.8 JTAG1.10 JTAG1.12 LED2.1(CATHODE) OSC1.2(GND) P2.1 Q1.2(S) R6.1 R12.1 R23.1 R32.1 R35.1 R36.2 R37.1 R44.2 R46.1 R51.1 R53.1 R55.2 R56.1 R65.1 R70.2 R71.1 R73.1 R85.2 R86.1 R88.2 R89.1 R96.2 R102.1 R103.1 R120.1 R123.1 R125.1 R132.1 R133.1 R134.1 R135.1 R139.1 R140.1 R141.1 R145.1 R146.1 R148.2 R150.1 R152.2 R153.2 R155.2 R157.2 R158.2 R160.2 R163.2 R229.1 R232.1 R235.1 R236.1 R237.1 R238.1 R239.1 R242.1 R246.1 R248.1 R250.1 R251.1 R253.1 R254.1 R255.1 R257.1 R274.1 R275.1 R276.1 R277.1 R278.1 R279.1 R280.1 R281.1 R300.2 R301.2 R302.2 R303.2 SW1.2 SW1.3 SW2.2 SW2.3 U1.1(GND) U3.1(AGND1) U3.5(AGND2) U3.9(SA_MODE) U3.11(DGND) U3.21(AGND3) U3.22(AGND4) U3.28(AGND5) U3.29(AGND6) U3.41(EPAD) U4.5(GND) U5.1(A0) U5.2(A1) U5.3(A2) U5.4(VSS) U5.7(#WC) U6.2(GND) U9.9(VSS) U10.1(AGND1) U10.5(AGND2) U10.9(SA_MODE) U10.11(DGND) U10.21(AGND3) U10.22(AGND4) U10.28(AGND5) U10.29(AGND6) U10.41(EPAD) U12.22(GND) U12.25(EXP) U13.4 U14.2(GND) U15.1(GND) U24.7(GND) U24.9(EP) U25.1(GND) U25.7(0V) U26.2(GND) U26.5(0V) U35.5(GND) U36.5(GND) U37.5(GND) U38.5(GND) U39.5(GND) U40.5(GND) U41.5(GND) U42.5(GND) U43.2(GND) U44.2(V-) USB1.5(GND) USB1.6(SH1) USB1.7(SH2) USB1.8(SH3) USB1.9(SH4) Y1.2(GND1) Y1.4(GND2) Z1.1 Z2.1
IOVDD: -1.1 C2.1 C4.1 C5.1 C10.1(VCC) C11.2 C18.1 C19.1 C24.1 C35.2 C42.1(VCC) C43.1 C50.1 C72.1(VCC) C73.1 C82.1(VCC) C83.1 CON3.42 D2.2(K) D4.2(K) H1.1 JTAG1.5 L1.2 OSC1.4(VDD) R1.2 R3.1 R9.2 R10.1 R11.2 R14.2 R16.2 R17.2 R18.2 R19.1 R20.1 R21.1 R22.1 R30.2 R33.2 R38.1 R40.1 R41.2 R47.2 R58.1 R59.1 R61.1 R62.1 R72.2 R76.2 R81.2 R82.2 R92.2 R108.1 R116.2 R118.2 R121.2 R129.1 U1.4(V3) U1.16(VCC) U3.12(IO_VDD) U4.8(VCC) U5.8(VCC) U6.5(VIO) U9.18(VDD) U10.12(IO_VDD) U12.14(VDDIO) U13.1 U15.2(VOUT) U15.4(VOUT)  [also labelled +3.3V]
VBIAS_1V5: R149.1 R151.1 R154.1 R156.1 R159.1 R161.1 R162.1 R164.1 R258.1 R263.1 R265.1 R266.1 R267.1 R268.1 R269.1 R270.1 R282.1 R283.1 R284.1 R285.1 R286.1 R287.1 R288.1 R289.1 R290.2 R291.2 R292.2 R293.1 R294.2 R295.2 R296.2 R297.2 U44.1(OUT) U44.4(IN-)
VBIAS_1V5_RAW: C197.2 C198.2 U43.1(VBIAS) U44.3(IN+)
1: R300.1
2: R301.1
3: R302.1
4: R303.1
485DE: CON2.31 R51.2 U4.2(~{RE}) U4.3(DE)  [also labelled A4]
+24V_SYS: C102.1 C103.1 C104.1 C105.1 C106.1 C178.1 C179.2 C180.1 D7.1(C) D8.1(C) L4.1 L6.1 Q2.3(S) R127.2 R273.1 U24.2(VIN)
A1: CON2.39 R24.2 R63.2  [also labelled BCLK]
ADC_PD_RST_N: R47.1 R82.1 R108.2 R113.2 U3.6(#PD/#RST) U10.6(#PD/#RST)
ADIN1: 10.1 R264.1 R270.2 R281.2 U17.6(OUT)
ADIN2: 16.1 R260.1 R267.2 R278.2 U23.6(OUT)
ADIN3: 14.1 R261.1 R268.2 R279.2 U22.6(OUT)
ADIN4: 15.1 R262.1 R269.2 R280.2 U21.6(OUT)
ADIN5: 9.1 R252.1 R263.2 R275.2 U16.6(OUT)
ADIN6: 11.1 R249.1 R257.2 R258.2 U18.6(OUT)
ADIN7: 12.1 R256.1 R265.2 R276.2 U19.6(OUT)
ADIN8: 13.1 R259.1 R266.2 R277.2 U20.6(OUT)
AIN1_N: C7.2 R6.2 R8.2 U3.32(#AIN1)
AIN1_P: C7.1 R13.2 U3.33(AIN1)
AIN2_N: C16.2 R23.2 R25.2 U3.34(#AIN2)
AIN2_P: C16.1 R29.2 U3.35(AIN2)
AIN3_N: C26.2 R35.2 R39.2 U3.36(#AIN3)
AIN3_P: C26.1 R43.2 U3.37(AIN3)
AIN4_N: C38.2 R46.2 R48.2 U3.38(#AIN4)
AIN4_P: C38.1 R52.2 U3.39(AIN4)
AIN5_N: C45.2 R56.2 R57.2 U10.32(#AIN1)
AIN5_P: C45.1 R60.2 U10.33(AIN1)
AIN6_N: C49.2 R65.2 R67.2 U10.34(#AIN2)
AIN6_P: C49.1 R69.2 U10.35(AIN2)
AIN7_N: C60.2 R73.2 R74.2 U10.36(#AIN3)
AIN7_P: C60.1 R77.2 U10.37(AIN3)
AIN8_N: C71.2 R86.2 R91.2 U10.38(#AIN4)
AIN8_P: C71.1 R95.2 U10.39(AIN4)
B3: CON4.20 R66.2  [also labelled SDATAOUT12]
B4: CON4.18 R5.2  [also labelled ZERO/USER]
C01: JP8.2 R179.2 R180.1 U38.15(D2)
C2: CON2.35 R26.2 R64.2  [also labelled LRCLK]
C02: JP16.2 R196.2 R197.1 U38.10(D3)
C3: CON4.30 LED1.2(ANODE)  [also labelled STATUS]
C03: JP24.2 R213.2 R214.1 U38.2(D1)
C4: CON4.24 R68.2  [also labelled SDATAOUT11]
C04: JP32.2 R230.2 R231.1 U38.7(D4)
C5: CON4.26 R28.2  [also labelled SDATAOUT02]
C11: JP6.2 R173.2 R174.1 U36.15(D2)
C12: JP13.2 R189.2 R190.1 U36.10(D3)
C13: JP21.2 R207.2 R208.1 U36.2(D1)
C14: JP29.2 R223.2 R224.1 U36.7(D4)
C19: CON3.30 U7.1  [also labelled UART0_RXD]
C21: JP5.2 R175.2 R176.1 U35.15(D2)
C22: JP14.2 R191.2 R192.1 U35.10(D3)
C23: JP22.2 R209.2 R210.1 U35.2(D1)
C24: JP30.2 R225.2 R226.1 U35.7(D4)
C31: JP7.2 R177.2 R178.1 U37.15(D2)
C32: JP15.2 R193.2 R194.1 U37.10(D3)
C33: JP23.2 R211.2 R212.1 U37.2(D1)
C34: JP31.2 R227.2 R228.1 U37.7(D4)
C41: JP2.2 R167.2 R168.1 U40.15(D2)
C42: JP10.2 R183.2 R184.1 U40.10(D3)
C43: JP18.2 R201.2 R202.1 U40.2(D1)
C44: JP26.2 R217.2 R218.1 U40.7(D4)
C51: JP1.2 R165.2 R166.1 U41.15(D2)
C52: JP9.2 R181.2 R182.1 U41.10(D3)
C53: JP17.2 R198.2 R199.1 U41.2(D1)
C54: JP25.2 R215.2 R216.1 U41.7(D4)
C61: JP3.2 R169.2 R170.1 U42.15(D2)
C62: JP11.2 R185.2 R186.1 U42.10(D3)
C63: JP19.2 R203.2 R204.1 U42.2(D1)
C64: JP27.2 R219.2 R220.1 U42.7(D4)
C71: JP4.2 R171.2 R172.1 U39.15(D2)
C72: JP12.2 R187.2 R188.1 U39.10(D3)
C73: JP20.2 R205.2 R206.1 U39.2(D1)
C74: JP28.2 R221.2 R222.1 U39.7(D4)
CAN_CS_N: R41.1 R107.2 U9.16(CS#)
CAN_H: D3.1 J2.21 R45.1 R49.2
CAN_INT_N: CON2.25 R33.1 U9.12(INT#)
CAN_L: D3.2 J2.22 R54.1 U8.2
CAN_RST_N: C17.2 D2.1(A) R30.1 R115.2 U9.17(RESET#)
CAN_SCK: R99.2 U9.13(SCK)
CAN_SI: R101.2 U9.14(SI)
CAN_SO: R100.2 U9.15(SO)
CH340_D+: U1.5(D+) USB1.3(D+)
CH340_D-: U1.6(D-) USB1.2(D-)
CHASSIS_GND: C69.2 R85.1 R96.1 RJ1.8 RJ1.13(SHELL) RJ1.14(SHELL)
CS0: C153.2 JP8.1 JP16.1 JP24.1 JP32.1 R247.2 U38.3(S1) U38.6(S4) U38.11(S3) U38.14(S2)
CS1: C150.2 JP6.1 JP13.1 JP21.1 JP29.1 R243.2 U36.3(S1) U36.6(S4) U36.11(S3) U36.14(S2)
CS2: C151.2 JP5.1 JP14.1 JP22.1 JP30.1 R244.2 U35.3(S1) U35.6(S4) U35.11(S3) U35.14(S2)
CS3: C152.2 JP7.1 JP15.1 JP23.1 JP31.1 R245.2 U37.3(S1) U37.6(S4) U37.11(S3) U37.14(S2)
CS4: C147.2 JP2.1 JP10.1 JP18.1 JP26.1 R234.2 U40.3(S1) U40.6(S4) U40.11(S3) U40.14(S2)
CS5: C146.2 JP1.1 JP9.1 JP17.1 JP25.1 R233.2 U41.3(S1) U41.6(S4) U41.11(S3) U41.14(S2)
CS6: C148.2 JP3.1 JP11.1 JP19.1 JP27.1 R240.2 U42.3(S1) U42.6(S4) U42.11(S3) U42.14(S2)
CS7: C149.2 JP4.1 JP12.1 JP20.1 JP28.1 R241.2 U39.3(S1) U39.6(S4) U39.11(S3) U39.14(S2)
D4: CON4.28 R31.2  [also labelled SDATAOUT01]
D16: CON3.36 R78.2
D18: CON3.32 U7.3  [also labelled UART0_TXD]
D19: CON3.22 R7.1  [also labelled eHRPWM0A]
E4: CON4.22 R112.2
E17: CON3.34 R75.2
E18: CON2.17 R105.1
E19: CON2.23 R110.1
ETH_AVDD3V3: C54.1(VCC) C56.1 L1.1 U12.2(VDDA_3.3)
ETH_LED0_N: RJ1.9(G-) U12.23(LED0/ANEN_SPEED)
ETH_RXM: D5.6(D1-) RJ1.6 U12.3(RXM)
ETH_RXP: D5.4(D2-) RJ1.4 U12.4(RXP)
ETH_TXM: D5.3(D2+) RJ1.3 U12.5(TXM)
ETH_TXP: D5.1(D1+) RJ1.1 U12.6(TXP)
F16: CON2.15 U1.3(RXD)  [also labelled UART2_TXD]
F17: CON2.13 U1.2(TXD)  [also labelled UART2_RXD]
F18: CON2.21 R107.1
F19: CON2.19 R106.1
G16: CON2.9 R21.2 R38.2 R61.2 U3.18(SCL/CCLK) U5.6(SCL) U10.18(SCL/CCLK)  [also labelled SCL]
G17: CON2.5 R101.1
G18: CON2.11 R22.2 R40.2 R62.2 U3.17(SDA/COUT) U5.5(SDA) U10.17(SDA/COUT)  [also labelled SDA]
G19: CON2.1 R99.1
GAIN_X1: R124.1 R125.2 U35.8(IN4) U36.8(IN4) U37.8(IN4) U38.8(IN4) U39.8(IN4) U40.8(IN4) U41.8(IN4) U42.8(IN4)
GAIN_X10: R121.1 R122.1 U35.1(IN1) U36.1(IN1) U37.1(IN1) U38.1(IN1) U39.1(IN1) U40.1(IN1) U41.1(IN1) U42.1(IN1)
GAIN_X30: R118.1 R119.1 U35.9(IN3) U36.9(IN3) U37.9(IN3) U38.9(IN3) U39.9(IN3) U40.9(IN3) U41.9(IN3) U42.9(IN3)
GAIN_X99: R116.1 R117.1 U35.16(IN2) U36.16(IN2) U37.16(IN2) U38.16(IN2) U39.16(IN2) U40.16(IN2) U41.16(IN2) U42.16(IN2)
GPIO0_0/ECAP1: H1.5 R112.1
GPIO2_12: R104.2 R299.2
GPIO2_14/EPWM1B: H1.4 R110.2
GPIO6_14/CLKOUT: H1.6 R83.2
GPIO8_1: H1.7 R78.1
GPIO8_2: H1.8 R75.1
H1-3: H1.3 R298.2 R299.1
H16: CON2.7 R104.1
H17: CON2.3 R100.1
IO1+: 18.1 C125.2 J2.1 R136.2 R152.1 U17.3(+IN)
IO1-: 2.1 C88.1 J2.2 R136.1 U17.2(-IN)
IO2+: 24.1 C136.2 J2.3 R147.2 R163.1 U23.3(+IN)
IO2-: 8.1 C95.1 J2.4 R147.1 U23.2(-IN)
IO3+: 22.1 C134.2 J2.5 R143.2 R158.1 U22.3(+IN)
IO3-: 5.1 C94.1 J2.6 R143.1 U22.2(-IN)
IO4+: 23.1 C132.2 J2.7 R144.2 R160.1 U21.3(+IN)
IO4-: 6.1 C91.1 J2.8 R144.1 U21.2(-IN)
IO5+: 17.1 C122.2 J2.9 R130.2 R148.1 U16.3(+IN)
IO5-: 1.1 C87.1 J2.10 R130.1 U16.2(-IN)
IO6+: 19.1 C127.2 J2.11 R137.2 R153.1 U18.3(+IN)
IO6-: 3.1 C89.1 J2.12 R137.1 U18.2(-IN)
IO7+: 20.1 C128.2 J2.13 R138.2 R155.1 U19.3(+IN)
IO7-: 7.1 C90.1 J2.14 R138.1 U19.2(-IN)
IO8+: 21.1 C130.2 J2.15 R142.2 R157.1 U20.3(+IN)
IO8-: 4.1 C93.1 J2.16 R142.1 U20.2(-IN)
J15: CON3.23 JTAG1.11  [also labelled UP_TCK]
J16: CON3.29 JTAG1.13  [also labelled UP_EMU0]
J18: CON3.19 JTAG1.7  [also labelled UP_TDO]
K16: CON3.27 JTAG1.14  [also labelled UP_EMU1]
K17: CON3.31 JTAG1.9  [also labelled UP_RTCK]
L16: CON3.21 JTAG1.1  [also labelled UP_TMS]
L17: CON3.25 JTAG1.2  [also labelled UP_TRSTN]
M16: CON3.17 JTAG1.3  [also labelled UP_TDI]
MCLK: R27.2 U3.7(MCLKIN) U10.7(MCLKIN)
MDCLK/MDC: R80.1 U12.11(MDC)
MDIO: R84.1 R92.1 U12.10(MDIO)
OUT1_P: C6.1 R180.2 R197.2 R214.2 R231.2 U34.6(OUT)
OUT2_P: C15.2 R174.2 R190.2 R208.2 R224.2 U31.6(OUT)
OUT3_P: C25.2 R176.2 R192.2 R210.2 R226.2 U32.6(OUT)
OUT4_P: C37.2 R178.2 R194.2 R212.2 R228.2 U33.6(OUT)
OUT5_P: C44.2 R168.2 R184.2 R202.2 R218.2 U28.6(OUT)
OUT6_P: C48.2 R166.2 R182.2 R199.2 R216.2 U27.6(OUT)
OUT7_P: C59.2 R170.2 R186.2 R204.2 R220.2 U29.6(OUT)
OUT8_P: C70.2 R172.2 R188.2 R206.2 R222.2 U30.6(OUT)
PHY_RST_N: C55.2 D4.1(A) R72.1 R79.2 U12.24(RST#)
PULSE_24V_GND: D1.2(A) P1.1 U2.3
PULSE_EXT_24V+: P1.3 R2.1
PULSE_OUT: D1.1(C) P1.2 R4.2 U2.4
R1: BOOT1.6 CON4.7  [also labelled VPIF_OUT12/LCD_D12]
R14: CON2.22 R114.2
RMII_CRS_DV: CON2.32 R94.2  [also labelled W19]
RMII_REFCLK: CON2.30 R93.2  [also labelled W18]
RMII_RXD0: CON2.26 R98.2  [also labelled V17]
RMII_RXD1: CON2.24 R97.1  [also labelled W16]
RMII_RXER: CON2.28 R90.2  [also labelled W17]
RMII_TXD0: R111.1 U12.20(TXD0)
RMII_TXD1: R109.1 U12.21(TXD1)
RMII_TXEN: R114.1 U12.19(TXEN)
RXCAN: U9.2(RXCAN) U11.1
RXCAN_1: U6.4(RXD) U11.2
SYS_RESET_INPUT: C9.2 CON3.41 R10.2 R15.2 Z2.2
T1: BOOT1.9 CON4.13  [also labelled VPIF_OUT9/LCD_D9]
T2: BOOT1.8 CON4.11  [also labelled VPIF_OUT10/LCD_D10]
T3: BOOT1.7 CON4.9  [also labelled VPIF_OUT11/LCD_D11]
T15: CON4.40 R124.2
T17: CON3.39 R79.1
T18: CON3.43 R83.1
TXCAN: U9.1(TXCAN) U11.3
TXCAN_1: U6.1(TXD) U11.4
U3: BOOT1.10 CON4.15  [also labelled VPIF_OUT8/LCD_D8]
U16: CON4.38 R122.2
U17: CON4.34 R117.2
U18: CON2.18 R109.2
UART0_RXD_1: U4.1(RXD) U7.2
UART0_TXD_1: R129.2 U4.4(TXD) U7.4
UART1_RXD: R105.2 U13.3
UART1_TXD: R106.2 U13.2
V16: CON2.20 R111.2
W15: CON4.36 R119.2
XI: C76.2 U12.8(XI) Y1.3
XO: C77.2 U12.7(XO) Y1.1
NetBOOT1_1: BOOT1.1 R9.1
NetBOOT1_2: BOOT1.2 R11.1
NetBOOT1_3: BOOT1.3 R14.1
NetBOOT1_4: BOOT1.4 R16.1
NetBOOT1_5: BOOT1.5 R17.1
NetC1_2: C1.2 R1.1 R5.1 SW1.1 SW1.4 Z1.2
NetC3_1: C3.1 R8.1 R282.2
NetC3_2: C3.2 R120.2
NetC6_2: C6.2 R13.1
NetC12_1: C12.1 R25.1 R283.2
NetC12_2: C12.2 R123.2
NetC13_2: C13.2 U1.8(XO) X1.2(OSC2)
NetC14_2: C14.2 U1.7(XI) X1.1(OSC1)
NetC15_1: C15.1 R29.1
NetC20_1: C20.1 R39.1 R284.2
NetC20_2: C20.2 R133.2
NetC25_1: C25.1 R43.1
NetC28_1: C28.1 C29.1(VCC) U3.2(VREF)
NetC30_2: C30.2 C32.2 R53.2 U3.10(DVDD)
NetC31_1: C31.1 C34.1 U3.3(PLL_FILT)
NetC31_2: C31.2 R50.1
NetC33_1: C33.1 R48.1 R285.2
NetC33_2: C33.2 R134.2
NetC36_1: C36.1 U9.8(OSC1) X2.2(OSC2)
NetC37_1: C37.1 R52.1
NetC40_1: C40.1 U9.7(OSC2) X2.1(OSC1)
NetC41_1: C41.1 R57.1 R286.2
NetC41_2: C41.2 R135.2
NetC44_1: C44.1 R60.1
NetC47_1: C47.1 R67.1 R287.2
NetC47_2: C47.2 R139.2
NetC48_1: C48.1 R69.1
NetC53_1: C53.1 R74.1 R288.2
NetC53_2: C53.2 R140.2
NetC57_2: C57.2 C58.2 U12.1(VDD_1.2)
NetC59_1: C59.1 R77.1
NetC61_2: C61.2 C65.2 R89.2 U10.10(DVDD)
NetC62_1: C62.1 C63.1(VCC) U10.2(VREF)
NetC64_1: C64.1 C66.1 U10.3(PLL_FILT)
NetC64_2: C64.2 R87.1
NetC67_1: C67.1 R91.1 R289.2
NetC67_2: C67.2 R141.2
NetC70_1: C70.1 R95.1
NetC74_1: C74.1 RJ1.5
NetC75_1: C75.1 RJ1.2
NetC79_2: C79.2 L2.1 U14.5(OUT)
NetC84_1: C84.1(VCC) C85.1 R126.2 U15.3(VIN)
NetC86_1: C86.1 U24.1(BOOT)
NetC86_2: C86.2 D6.1(K) L3.1 U24.8(SW)
NetC108_2: C108.2 R128.2 U24.6(COMP)
NetC112_2: C112.2 C118.1 L5.1 U26.6(-VO)
NetC117_2: C117.2 R128.1
NetC123_1: C123.1 C155.2 L7.1 U26.4(+VO)
NetC138_1: C138.1(VCC) C139.1 L4.2 U25.2(VIN)
NetC140_1: C140.1(VCC) R195.2 U25.6(+Vo)
NetC141_2: C141.2(GND) R200.2 U25.8(-Vo)
NetC146_1: C146.1 R233.1 U27.2(-IN)
NetC147_1: C147.1 R234.1 U28.2(-IN)
NetC148_1: C148.1 R240.1 U29.2(-IN)
NetC149_1: C149.1 R241.1 U30.2(-IN)
NetC150_1: C150.1 R243.1 U31.2(-IN)
NetC151_1: C151.1 R244.1 U32.2(-IN)
NetC152_1: C152.1 R245.1 U33.2(-IN)
NetC153_1: C153.1 R247.1 U34.2(-IN)
NetC156_1: C156.1 C157.1 C172.2 L6.2 U26.3(Vin)
NetC175_1: C175.1 U43.5(VREF)
NetCON2_27: CON2.27 R113.1
NetCON2_29: CON2.29 R115.1
NetCON3_38: CON3.38 R80.2
NetCON3_40: CON3.40 R84.2
NetCON5_1: CON5.1 J1.1 R34.1 U4.6(A)
NetCON5_2: CON5.2 R42.2 R55.1 U4.7(B)
NetD7_2: D7.2(A) Q2.1(G) R274.2
NetF1_1: F1.1 P2.2
NetF1_2: F1.2 SW3.2
NetJ1_2: J1.2 R42.1
NetLED1_1: LED1.1(CATHODE) R32.2
NetLED2_2: LED2.2(ANODE) R273.2
NetOSC1_1: OSC1.1(Tri-state) R18.1
NetOSC1_3: OSC1.3(OUT) R27.1
NetQ1_1: Q1.1(G) R7.2 R12.2
NetQ1_3: Q1.3(D) U2.2
NetQ2_2: Q2.2(D) Q2.4(D) SW3.3
NetR2_2: R2.2 R4.1
NetR3_2: R3.2 U2.1
NetR15_1: R15.1 SW2.1 SW2.4
NetR19_2: R19.2 R36.1 U3.20(ADDR1/CIN)
NetR20_2: R20.2 R37.2 U3.19(ADDR0/CLATCH)
NetR24_1: R24.1 U3.16(BCLK)
NetR26_1: R26.1 U3.15(LRCLK)
NetR28_1: R28.1 U3.14(SDATAOUT2)
NetR31_1: R31.1 U3.13(SDATAOUT1)
NetR44_1: R44.1 U6.8(S)
NetR45_2: R45.2 U6.7(CANH)
NetR49_1: R49.1 U8.1
NetR54_2: R54.2 U6.6(CANL)
NetR58_2: R58.2 R70.1 U10.20(ADDR1/CIN)
NetR59_2: R59.2 R71.2 U10.19(ADDR0/CLATCH)
NetR63_1: R63.1 U10.16(BCLK)
NetR64_1: R64.1 U10.15(LRCLK)
NetR66_1: R66.1 U10.14(SDATAOUT2)
NetR68_1: R68.1 U10.13(SDATAOUT1)
NetR76_1: R76.1 RJ1.10(G+)
NetR81_1: R81.1 R298.1 U12.18(INTRP)
NetR88_1: R88.1 U12.9(REXT)
NetR90_1: R90.1 R102.2 U12.17(RXER)
NetR93_1: R93.1 U12.16(REF_CLK)
NetR94_1: R94.1 R103.2 U12.15(CRS_DV/PHYAD[1:0])
NetR97_2: R97.2 U12.12(RXD1)
NetR98_1: R98.1 U12.13(RXD0)
NetR127_1: R127.1 R146.2 U24.3(EN)
NetR131_1: R131.1 R150.2 U24.5(FB)
NetR132_2: R132.2 U24.4(RT/CLK)
NetR145_2: R145.2 R149.2 U16.5(REF)
NetR151_2: R151.2 R235.2 U17.5(REF)
NetR154_2: R154.2 R229.2 U18.5(REF)
NetR156_2: R156.2 R232.2 U19.5(REF)
NetR159_2: R159.2 R237.2 U22.5(REF)
NetR161_2: R161.2 R236.2 U20.5(REF)
NetR162_2: R162.2 R238.2 U21.5(REF)
NetR164_2: R164.2 R239.2 U23.5(REF)
NetR165_1: R165.1 R181.1 R198.1 R215.1 R242.2 R290.1
NetR167_1: R167.1 R183.1 R201.1 R217.1 R246.2 R291.1
NetR169_1: R169.1 R185.1 R203.1 R219.1 R248.2 R292.1
NetR171_1: R171.1 R187.1 R205.1 R221.1 R250.2 R293.2
NetR173_1: R173.1 R189.1 R207.1 R223.1 R251.2 R294.1
NetR175_1: R175.1 R191.1 R209.1 R225.1 R253.2 R295.1
NetR177_1: R177.1 R193.1 R211.1 R227.1 R254.2 R296.1
NetR179_1: R179.1 R196.1 R213.1 R230.1 R255.2 R297.1
NetR249_2: R249.2 U27.3(+IN)
NetR252_2: R252.2 U28.3(+IN)
NetR256_2: R256.2 U29.3(+IN)
NetR259_2: R259.2 U30.3(+IN)
NetR260_2: R260.2 U31.3(+IN)
NetR261_2: R261.2 U32.3(+IN)
NetR262_2: R262.2 U33.3(+IN)
NetR264_2: R264.2 U34.3(+IN)
NetRg1_1: Rg1.1 U16.1(-RG)
NetRg1_2: Rg1.2 U16.8(+RG)
NetRg2_1: Rg2.1 U17.1(-RG)
NetRg2_2: Rg2.2 U17.8(+RG)
NetRg3_1: Rg3.1 U18.1(-RG)
NetRg3_2: Rg3.2 U18.8(+RG)
NetRg4_1: Rg4.1 U19.1(-RG)
NetRg4_2: Rg4.2 U19.8(+RG)
NetRg5_1: Rg5.1 U20.1(-RG)
NetRg5_2: Rg5.2 U20.8(+RG)
NetRg6_1: Rg6.1 U22.1(-RG)
NetRg6_2: Rg6.2 U22.8(+RG)
NetRg7_1: Rg7.1 U21.1(-RG)
NetRg7_2: Rg7.2 U21.8(+RG)
NetRg8_1: Rg8.1 U23.1(-RG)
NetRg8_2: Rg8.2 U23.8(+RG)

Not connected (* = marked no-connect by the designer): CON1 1 2 3 4 5 6 7 8 9 10 11 12 13 14 15 16 17 18 19 20 21 22 23 24 25 26 27 28 29 30 31 32 33 34 35 36 38 39 40 41 42 44 45 46 47 48 49; CON2 2 4 6 8 10 12 14 16 33 34 36 37 38 40 41 42 43 44 46 47 49; CON3 1 2 3 4 5 6 7 8 9 11 12 14 16 18 24 26 28 37 45; CON4 1 2 3 4 5 6 8 10 12 14 17 19 21 23 25 27 29 31 33 35 37 39 41 42 44 45 46 47 48; D5 5(NC); H1 10*; RJ1 7 11(Y-) 12(Y+); SW3 1 4 5; U1 9(CTS#)* 10(DSR#)* 11(RI#)* 12(DCD#)* 13(DTR#) 14(RTS#) 15(R232)*; U3 8(NC) 23(NC) 24(NC) 25(NC) 26(NC) 27(NC) 30(NC); U9 3(CLKOUT/SOF) 4(TX0RTS#) 5(TX1RTS#) 6(TX2RTS#) 10(RX1BF#) 11(RX0BF#); U10 8(NC) 23(NC) 24(NC) 25(NC) 26(NC) 27(NC) 30(NC); U14 4(N/C); U25 3(CTRL) 5(NC); U26 1(Ctrl)*; U27 1(VOSADJ) 5(VOSADJ) 8(NC); U28 1(VOSADJ) 5(VOSADJ) 8(NC); U29 1(VOSADJ) 5(VOSADJ) 8(NC); U30 1(VOSADJ) 5(VOSADJ) 8(NC); U31 1(VOSADJ) 5(VOSADJ) 8(NC); U32 1(VOSADJ) 5(VOSADJ) 8(NC); U33 1(VOSADJ) 5(VOSADJ) 8(NC); U34 1(VOSADJ) 5(VOSADJ) 8(NC); U35 12(NC)*; U36 12(NC)*; U37 12(NC)*; U38 12(NC)*; U39 12(NC)*; U40 12(NC)*; U41 12(NC)*; U42 12(NC)*; USB1 1(VBUS) 4(ID)

## Layout directives
differential pair: AIN1_N, AIN1_P, AIN2_N, AIN2_P, AIN3_N, AIN3_P, AIN4_N, AIN4_P, AIN5_N, AIN5_P, AIN6_N, AIN6_P, AIN7_N, AIN7_P, AIN8_N, AIN8_P

## Notes on the sheet
- 输出脉冲与光耦隔离
- 校零按键，复位按键以及状态指示灯
- JTAG
- BOOT0
- BOOT1
- BOOT3
- BOOT2
- BOOT4
- (near U5) E2PROM
- CAN
- RS485
- 网口
- 机壳地耦合预留
- (near R83) LCD_MCLK/GPIO8[10]
- EEPROM
- USART
- 一
- +
- 多路开关
- JP为手动跳线，调试专用，默认不装
- Labels drawn without touching a wire or pin: F4, K14